# Altium project Nyquist_LA.PrjPcb
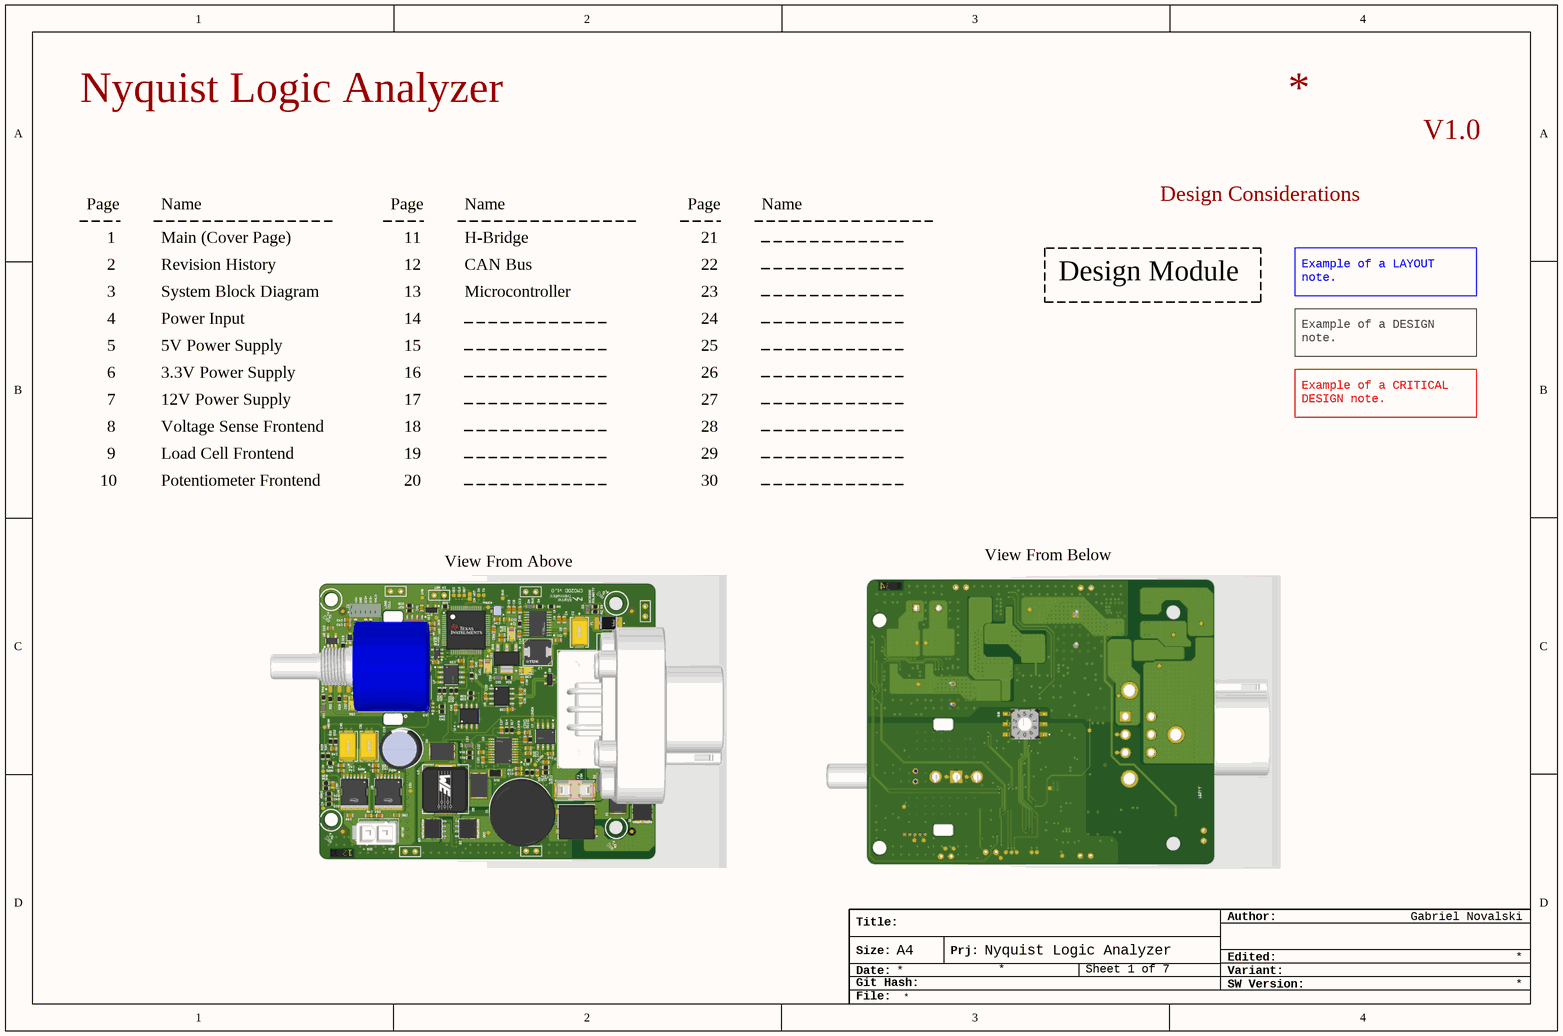
[diagram p0: Main.SchDoc]
ProjectTitle: Nyquist Logic Analyzer; Author: Gabriel Novalski
9 sheets, 204 parts. Net scope: strictly hierarchical (ports join the sheet entries above them; power ports are local).
Board file: PCB.PcbDoc
Sheets:
  Main.SchDoc
  Nyquist_LA_Top.SchDoc
    U_Power_Supply = Power_Supply.SchDoc
    U_USB_Input = USB_Input.SchDoc
    U_FPGA_iCE40HX4K = FPGA_iCE40HX4K.SchDoc
    U_Probe_Connectors = Probe_Connectors.SchDoc
    U_FT2232H_USB_Converter = FT2232H_USB_Converter.SchDoc
    U_JEDEC_TSSOP54_SDRAM = JEDEC_TSSOP54_SDRAM.SchDoc
    U_Input_Frontend = Input_Comparator_Frontend.SchDoc
    U_Input_Frontend = Input_Comparator_Frontend.SchDoc
    U_Input_Frontend = Input_Comparator_Frontend.SchDoc
    U_Input_Frontend = Input_Comparator_Frontend.SchDoc

## Sheet Main.SchDoc
size A4; SheetNumber: 1; SheetTotal: 7

### Notes on the sheet
- Nyquist Logic Analyzer
- V1.0
- Page
- 1
- Name
- Main (Cover Page)
- 11
- H-Bridge
- 21
- Design Considerations
- 2
- 3
- Revision History
- System Block Diagram
- 12
- 13
- CAN Bus
- Microcontroller
- 22
- 23
- Design Module
- Example of a LAYOUT note.
- 4
- 5
- 6
- Power Input
- 5V Power Supply
- 3.3V Power Supply
- 14
- 15
- 16
- 24
- 25
- 26
- Example of a DESIGN note.
- 7
- 8
- 12V Power Supply
- Voltage Sense Frontend
- 17
- 18
- 27
- 28
- Example of a CRITICAL DESIGN note.
- 10
- 9
- Load Cell Frontend
- Potentiometer Frontend
- 19
- 20
- 29
- 30
- View From Above
- View From Below
- Title:
- Author:
- Size:
- Date:
- Git Hash:
- A4
- Prj:
- SW Version:
- Variant:
- Edited:
- File:

## Sheet Nyquist_LA_Top.SchDoc: Nyquist LA Top
size A4; SheetNumber: 2; SheetTotal: 9
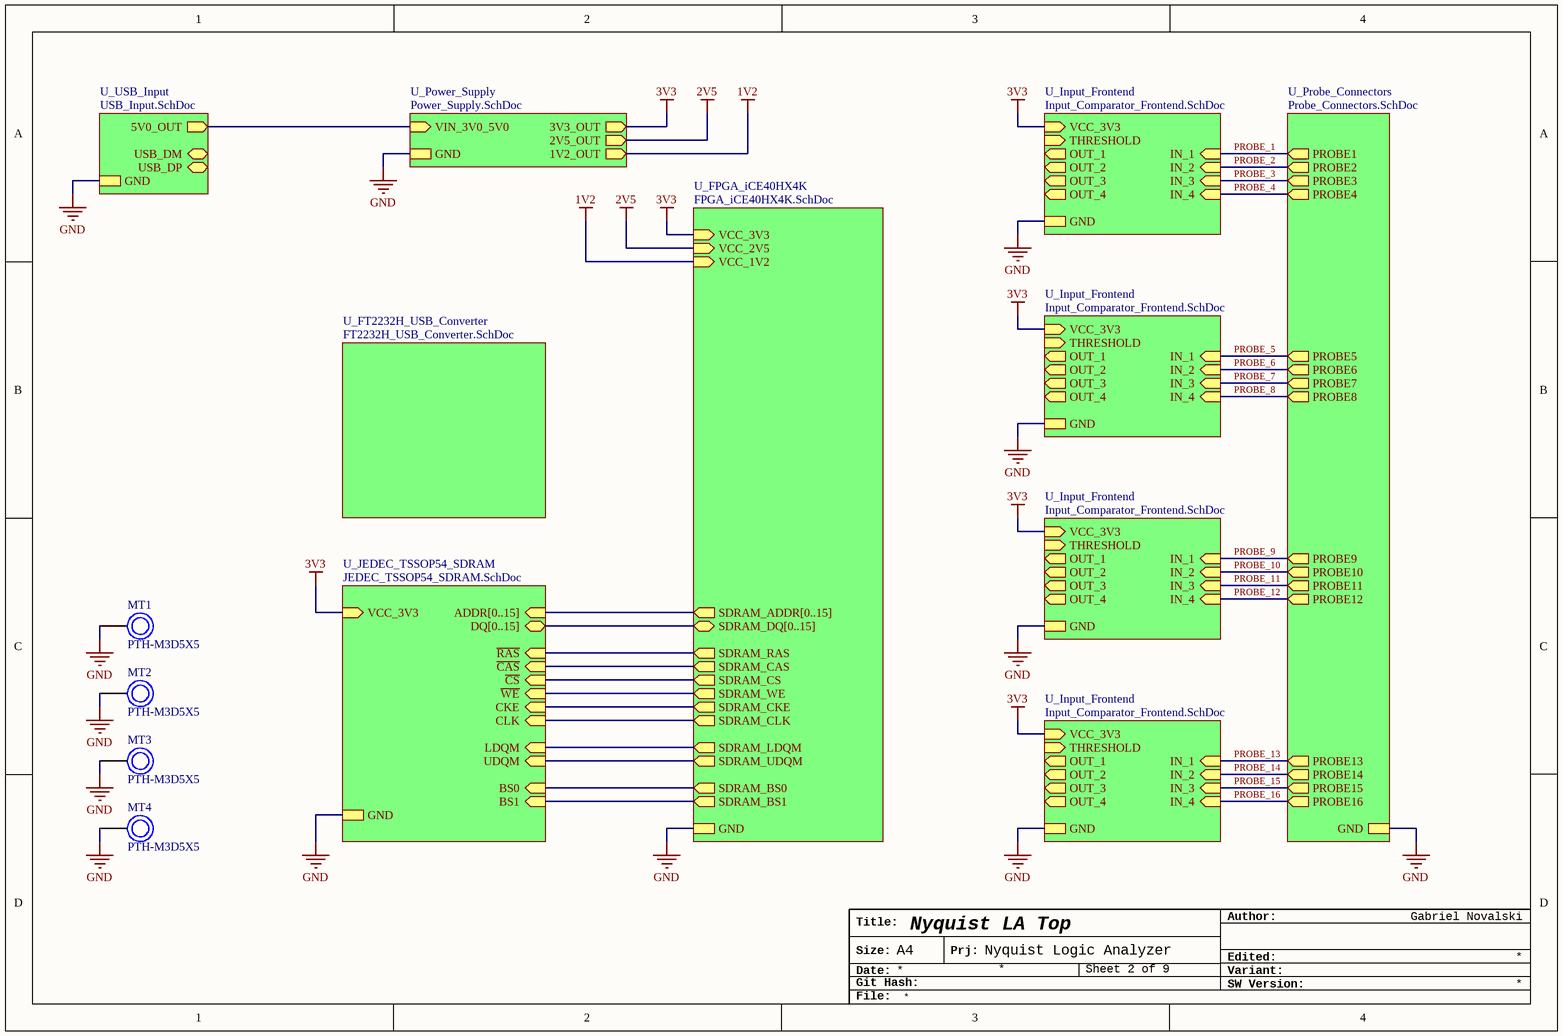
[diagram p1: Nyquist_LA_Top.SchDoc]

### Parts
MT1  PTH-M3D5X5  [M3_Mounting_Circular_Screw_L8mm]  (no BOM)
MT2  PTH-M3D5X5  [M3_Mounting_Circular_Screw_L8mm]  (no BOM)
MT3  PTH-M3D5X5  [M3_Mounting_Circular_Screw_L8mm]  (no BOM)
MT4  PTH-M3D5X5  [M3_Mounting_Circular_Screw_L8mm]  (no BOM)

### Sub-sheets
U_FPGA_iCE40HX4K = FPGA_iCE40HX4K.SchDoc: GND, VCC_3V3 (in), VCC_2V5 (in), VCC_1V2 (in), SDRAM_WE (out), SDRAM_CKE (out), SDRAM_CLK (out), SDRAM_LDQM (out), SDRAM_UDQM (out), SDRAM_BS0 (out), SDRAM_BS1 (out), SDRAM_ADDR[0..15] (out), SDRAM_DQ[0..15] (bidir), SDRAM_RAS (out), SDRAM_CAS (out), SDRAM_CS (out)
U_FT2232H_USB_Converter = FT2232H_USB_Converter.SchDoc: no entries
U_Input_Frontend = Input_Comparator_Frontend.SchDoc: IN_1 (in), IN_2 (in), IN_3 (in), IN_4 (in), OUT_1 (out), OUT_2 (out), OUT_3 (out), OUT_4 (out), GND, VCC_3V3 (in), THRESHOLD (in)
U_Input_Frontend = Input_Comparator_Frontend.SchDoc: IN_1 (in), IN_2 (in), IN_3 (in), IN_4 (in), OUT_1 (out), OUT_2 (out), OUT_3 (out), OUT_4 (out), GND, VCC_3V3 (in), THRESHOLD (in)
U_Input_Frontend = Input_Comparator_Frontend.SchDoc: IN_1 (in), IN_2 (in), IN_3 (in), IN_4 (in), OUT_1 (out), OUT_2 (out), OUT_3 (out), OUT_4 (out), GND, VCC_3V3 (in), THRESHOLD (in)
U_Input_Frontend = Input_Comparator_Frontend.SchDoc: IN_1 (in), IN_2 (in), IN_3 (in), IN_4 (in), OUT_1 (out), OUT_2 (out), OUT_3 (out), OUT_4 (out), GND, VCC_3V3 (in), THRESHOLD (in)
U_JEDEC_TSSOP54_SDRAM = JEDEC_TSSOP54_SDRAM.SchDoc: DQ[0..15] (bidir), ADDR[0..15] (in), GND, VCC_3V3 (in), ~{RAS} (in), ~{CAS} (in), ~{CS} (in), ~{WE} (in), CKE (in), CLK (in), LDQM (in), UDQM (in), BS0 (in), BS1 (in)
U_Power_Supply = Power_Supply.SchDoc: 3V3_OUT (out), 2V5_OUT (out), 1V2_OUT (out), VIN_3V0_5V0 (in), GND
U_Probe_Connectors = Probe_Connectors.SchDoc: GND, PROBE1 (out), PROBE2 (out), PROBE3 (out), PROBE4 (out), PROBE5 (out), PROBE6 (out), PROBE7 (out), PROBE8 (out), PROBE9 (out), PROBE10 (out), PROBE11 (out), PROBE12 (out), PROBE13 (out), PROBE14 (out), PROBE15 (out), PROBE16 (out)
U_USB_Input = USB_Input.SchDoc: 5V0_OUT (out), GND, USB_DM (bidir), USB_DP (bidir)

### Nets
1V2: sheet U_Power_Supply/1V2_OUT, sheet U_FPGA_iCE40HX4K/VCC_1V2
2V5: sheet U_Power_Supply/2V5_OUT, sheet U_FPGA_iCE40HX4K/VCC_2V5
3V3: sheet U_Power_Supply/3V3_OUT, sheet U_FPGA_iCE40HX4K/VCC_3V3, sheet U_JEDEC_TSSOP54_SDRAM/VCC_3V3, sheet U_Input_Frontend/VCC_3V3, sheet U_Input_Frontend/VCC_3V3, sheet U_Input_Frontend/VCC_3V3, sheet U_Input_Frontend/VCC_3V3
GND: MT1.MT MT2.MT MT3.MT MT4.MT ; sheet U_Power_Supply/GND, sheet U_USB_Input/GND, sheet U_FPGA_iCE40HX4K/GND, sheet U_Probe_Connectors/GND, sheet U_JEDEC_TSSOP54_SDRAM/GND, sheet U_Input_Frontend/GND, sheet U_Input_Frontend/GND, sheet U_Input_Frontend/GND, sheet U_Input_Frontend/GND
VIN_5V0: sheet U_Power_Supply/VIN_3V0_5V0, sheet U_USB_Input/5V0_OUT
PROBE_1: sheet U_Probe_Connectors/PROBE1, sheet U_Input_Frontend/IN_1
PROBE_2: sheet U_Probe_Connectors/PROBE2, sheet U_Input_Frontend/IN_2
PROBE_3: sheet U_Probe_Connectors/PROBE3, sheet U_Input_Frontend/IN_3
PROBE_4: sheet U_Probe_Connectors/PROBE4, sheet U_Input_Frontend/IN_4
PROBE_5: sheet U_Probe_Connectors/PROBE5, sheet U_Input_Frontend/IN_1
PROBE_6: sheet U_Probe_Connectors/PROBE6, sheet U_Input_Frontend/IN_2
PROBE_7: sheet U_Probe_Connectors/PROBE7, sheet U_Input_Frontend/IN_3
PROBE_8: sheet U_Probe_Connectors/PROBE8, sheet U_Input_Frontend/IN_4
PROBE_9: sheet U_Probe_Connectors/PROBE9, sheet U_Input_Frontend/IN_1
PROBE_10: sheet U_Probe_Connectors/PROBE10, sheet U_Input_Frontend/IN_2
PROBE_11: sheet U_Probe_Connectors/PROBE11, sheet U_Input_Frontend/IN_3
PROBE_12: sheet U_Probe_Connectors/PROBE12, sheet U_Input_Frontend/IN_4
PROBE_13: sheet U_Probe_Connectors/PROBE13, sheet U_Input_Frontend/IN_1
PROBE_14: sheet U_Probe_Connectors/PROBE14, sheet U_Input_Frontend/IN_2
PROBE_15: sheet U_Probe_Connectors/PROBE15, sheet U_Input_Frontend/IN_3
PROBE_16: sheet U_Probe_Connectors/PROBE16, sheet U_Input_Frontend/IN_4
SDRAM_#CAS: sheet U_FPGA_iCE40HX4K/SDRAM_CAS, sheet U_JEDEC_TSSOP54_SDRAM/~{CAS}
SDRAM_#CS: sheet U_FPGA_iCE40HX4K/SDRAM_CS, sheet U_JEDEC_TSSOP54_SDRAM/~{CS}
SDRAM_#RAS: sheet U_FPGA_iCE40HX4K/SDRAM_RAS, sheet U_JEDEC_TSSOP54_SDRAM/~{RAS}
SDRAM_#WE: sheet U_FPGA_iCE40HX4K/SDRAM_WE, sheet U_JEDEC_TSSOP54_SDRAM/~{WE}
SDRAM_BS0: sheet U_FPGA_iCE40HX4K/SDRAM_BS0, sheet U_JEDEC_TSSOP54_SDRAM/BS0
SDRAM_BS1: sheet U_FPGA_iCE40HX4K/SDRAM_BS1, sheet U_JEDEC_TSSOP54_SDRAM/BS1
SDRAM_CKE: sheet U_FPGA_iCE40HX4K/SDRAM_CKE, sheet U_JEDEC_TSSOP54_SDRAM/CKE
SDRAM_CLK: sheet U_FPGA_iCE40HX4K/SDRAM_CLK, sheet U_JEDEC_TSSOP54_SDRAM/CLK
SDRAM_LDQM: sheet U_FPGA_iCE40HX4K/SDRAM_LDQM, sheet U_JEDEC_TSSOP54_SDRAM/LDQM
SDRAM_UDQM: sheet U_FPGA_iCE40HX4K/SDRAM_UDQM, sheet U_JEDEC_TSSOP54_SDRAM/UDQM

### Buses and harness runs
bus sheet U_FPGA_iCE40HX4K/SDRAM_ADDR[0..15] = sheet U_JEDEC_TSSOP54_SDRAM/ADDR[0..15]
bus sheet U_FPGA_iCE40HX4K/SDRAM_DQ[0..15] = sheet U_JEDEC_TSSOP54_SDRAM/DQ[0..15]

### Notes on the sheet
- Title:
- Author:
- Size:
- Date:
- Git Hash:
- A4
- Prj:
- SW Version:
- Variant:
- Edited:
- File:

### Library data of the parts
MT1-MT4 = M3_Mounting_Hole: Mounting Hole 5mm x 5mm for M3 screws; Rule: UNIONINDEX=0|RULEKIND=PolygonConnect|NETSCOPE=AnyNet|LAYERKIND=SameLayer|NAME=Schematic Polygon Connect Style|CONNECTSTYLE=Direct|RELIEFCONDUCTORWIDTH=10mil|RELIEFENTRIES=4|POLYGONRELIEFANGLE=90 Angle|AIRGAPWIDTH=10mil|UNIT=Imperial

## Sheet Power_Supply.SchDoc: Power Supply
size A3; SheetNumber: 4; SheetTotal: 7
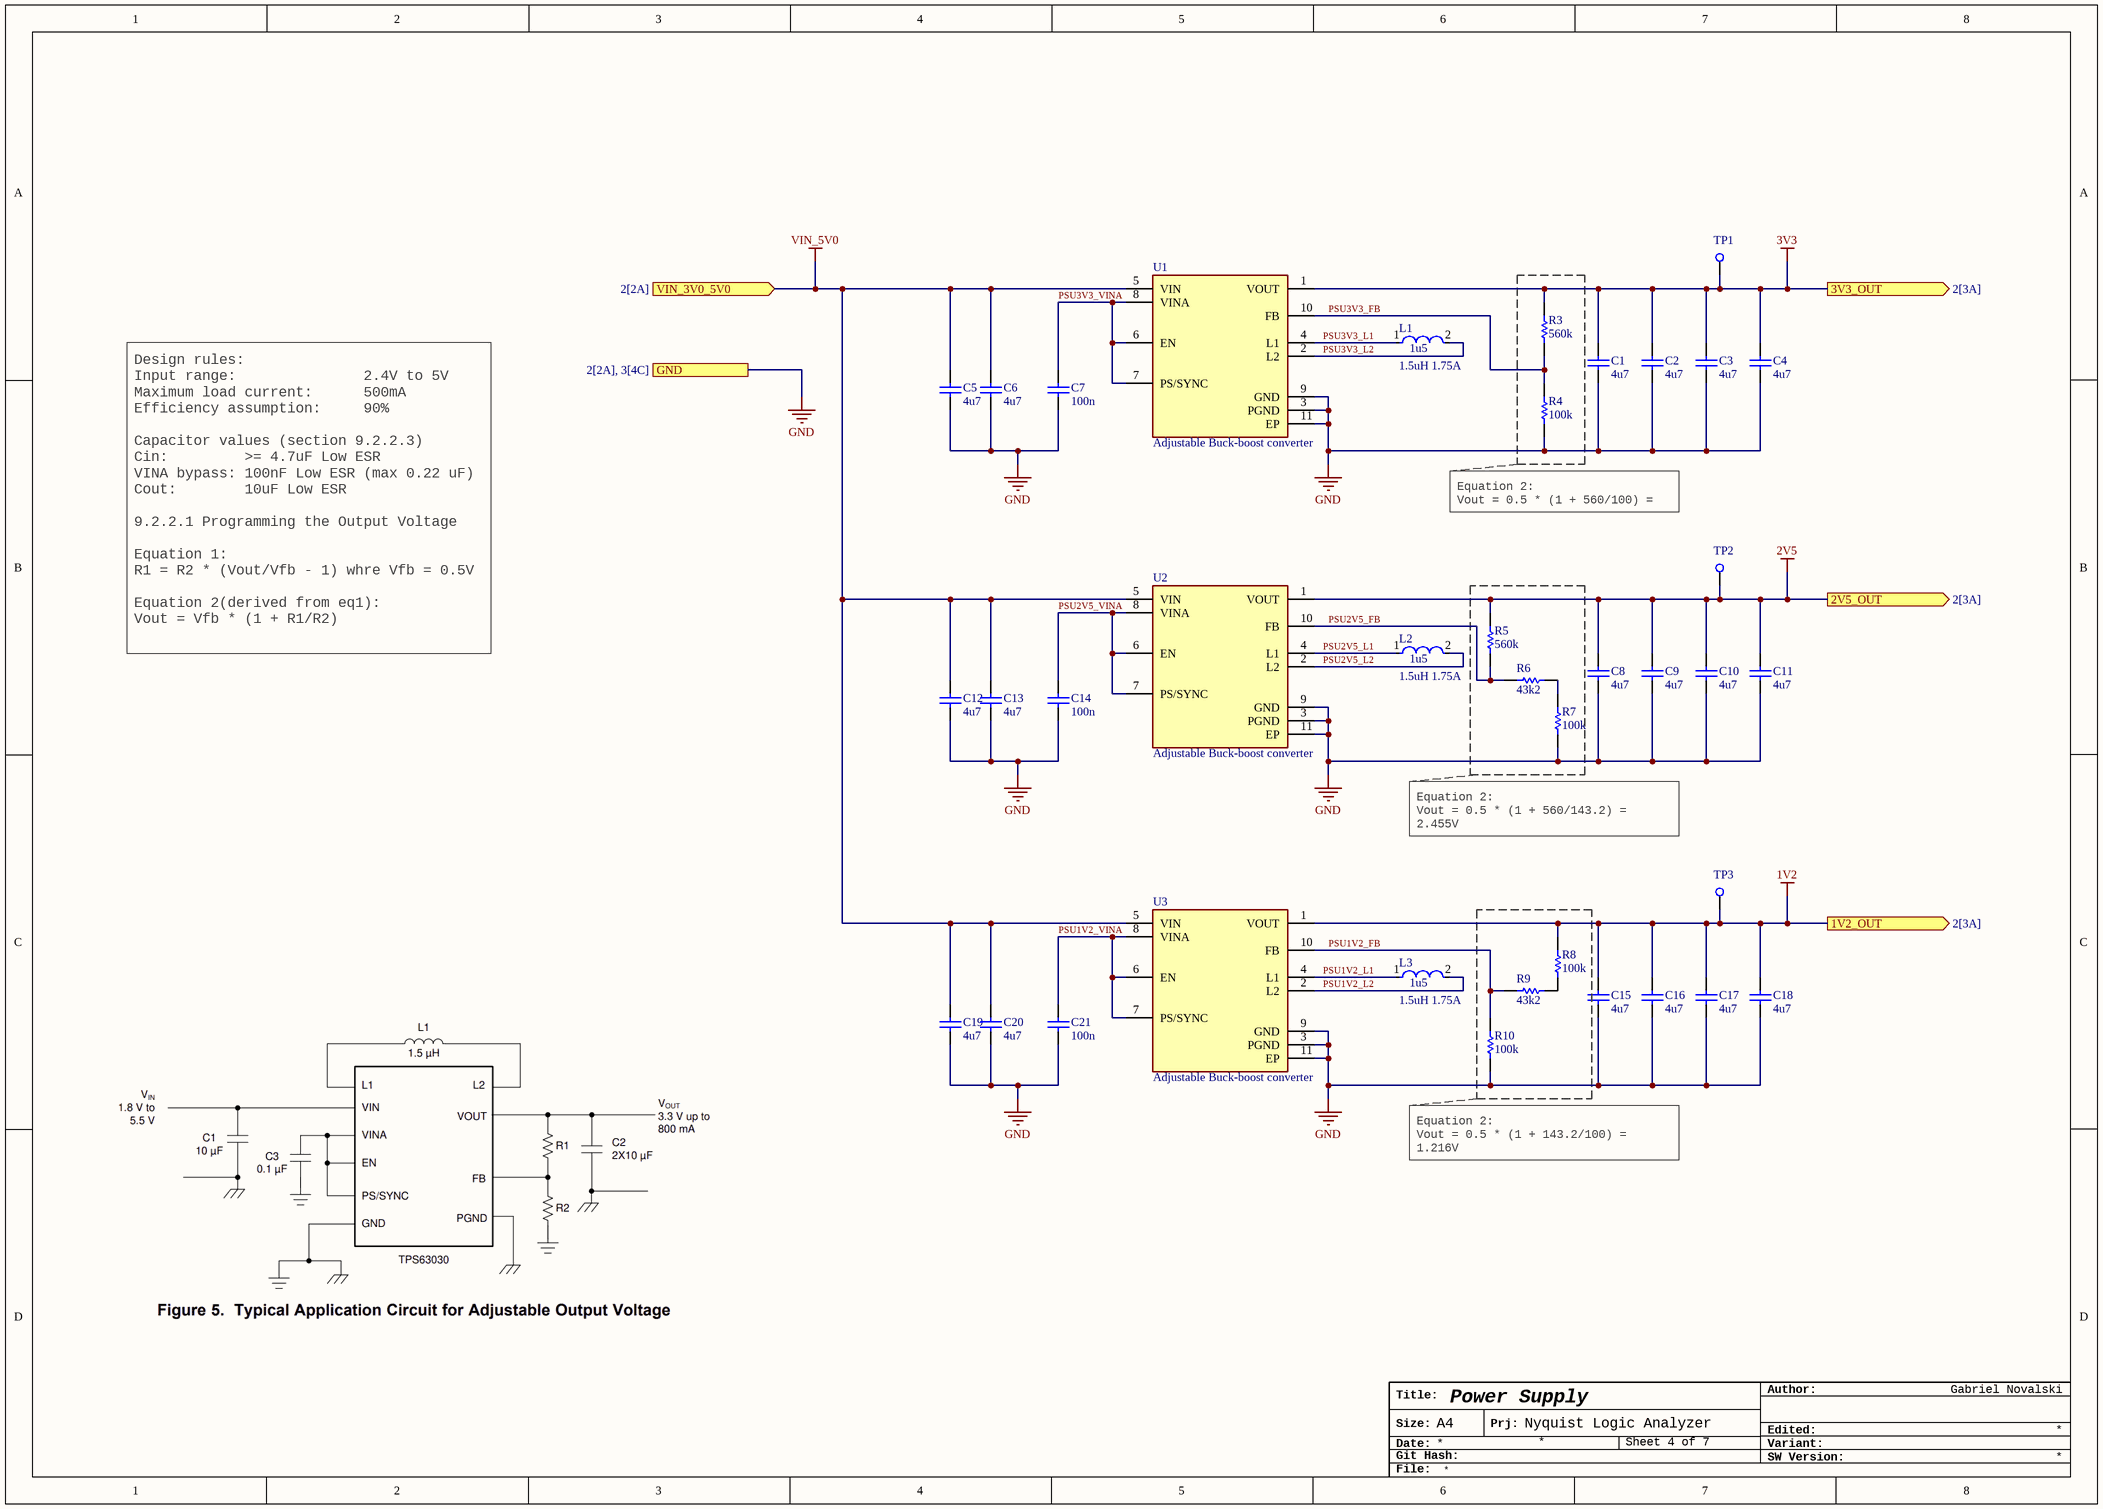
[diagram p2: Power_Supply.SchDoc]

### Parts
C1  value 4u7  [CAPC1607X09L - 0603]  (hidden comment: 4.7uF 35V)
C2  value 4u7  [CAPC1607X09L - 0603]  (hidden comment: 4.7uF 35V)
C3  value 4u7  [CAPC1607X09L - 0603]  (hidden comment: 4.7uF 35V)
C4  value 4u7  [CAPC1607X09L - 0603]  (hidden comment: 4.7uF 35V)
C5  value 4u7  [CAPC1607X09L - 0603]  (hidden comment: 4.7uF 35V)
C6  value 4u7  [CAPC1607X09L - 0603]  (hidden comment: 4.7uF 35V)
C7  value 100n  [CAPC1607X09L - 0603]  (hidden comment: 100nF 50V)
C8  value 4u7  [CAPC1607X09L - 0603]  (hidden comment: 4.7uF 35V)
C9  value 4u7  [CAPC1607X09L - 0603]  (hidden comment: 4.7uF 35V)
C10  value 4u7  [CAPC1607X09L - 0603]  (hidden comment: 4.7uF 35V)
C11  value 4u7  [CAPC1607X09L - 0603]  (hidden comment: 4.7uF 35V)
C12  value 4u7  [CAPC1607X09L - 0603]  (hidden comment: 4.7uF 35V)
C13  value 4u7  [CAPC1607X09L - 0603]  (hidden comment: 4.7uF 35V)
C14  value 100n  [CAPC1607X09L - 0603]  (hidden comment: 100nF 50V)
C15  value 4u7  [CAPC1607X09L - 0603]  (hidden comment: 4.7uF 35V)
C16  value 4u7  [CAPC1607X09L - 0603]  (hidden comment: 4.7uF 35V)
C17  value 4u7  [CAPC1607X09L - 0603]  (hidden comment: 4.7uF 35V)
C18  value 4u7  [CAPC1607X09L - 0603]  (hidden comment: 4.7uF 35V)
C19  value 4u7  [CAPC1607X09L - 0603]  (hidden comment: 4.7uF 35V)
C20  value 4u7  [CAPC1607X09L - 0603]  (hidden comment: 4.7uF 35V)
C21  value 100n  [CAPC1607X09L - 0603]  (hidden comment: 100nF 50V)
L1  1.5uH 1.75A  value 1u5  [LQH32PB_N0-MFG]
L2  1.5uH 1.75A  value 1u5  [LQH32PB_N0-MFG]
L3  1.5uH 1.75A  value 1u5  [LQH32PB_N0-MFG]
R3  560k  [RESC1508X05L - 0603]
R4  100k  [RESC1508X05L - 0603]
R5  560k  [RESC1508X05L - 0603]
R6  value 43k2  [RESC1508X05L - 0603]  (hidden comment: 43.2k)
R7  100k  [RESC1508X05L - 0603]
R8  100k  [RESC1508X05L - 0603]
R9  value 43k2  [RESC1508X05L - 0603]  (hidden comment: 43.2k)
R10  100k  [RESC1508X05L - 0603]
TP1  Test Point  [TP_CIRC_SMD_1mm]  (value not drawn)  (no BOM)
TP2  Test Point  [TP_CIRC_SMD_1mm]  (value not drawn)  (no BOM)
TP3  Test Point  [TP_CIRC_SMD_1mm]  (value not drawn)  (no BOM)
U1  Adjustable Buck-boost converter  [SON10_2.5x2.5_GEN]
U2  Adjustable Buck-boost converter  [SON10_2.5x2.5_GEN]
U3  Adjustable Buck-boost converter  [SON10_2.5x2.5_GEN]

### Ports
1V2_OUT (out, see 2[3A]), 2V5_OUT (out, see 2[3A]), 3V3_OUT (out, see 2[3A]), GND (see 2[2A], 3[4C]), VIN_3V0_5V0 (in, see 2[2A])

### Nets
1V2: C15.2 C16.2 C17.2 C18.2 R8.2 TP3.1 U3.1(VOUT) ; port 1V2_OUT
2V5: C8.2 C9.2 C10.2 C11.2 R5.2 TP2.1 U2.1(VOUT) ; port 2V5_OUT
3V3: C1.2 C2.2 C3.2 C4.2 R3.2 TP1.1 U1.1(VOUT) ; port 3V3_OUT
GND: C1.1 C2.1 C3.1 C4.1 C5.1 C6.1 C7.1 C8.1 C9.1 C10.1 C11.1 C12.1 C13.1 C14.1 C15.1 C16.1 C17.1 C18.1 C19.1 C20.1 C21.1 R4.1 R7.1 R10.1 U1.3(PGND) U1.9(GND) U1.11(EP) U2.3(PGND) U2.9(GND) U2.11(EP) U3.3(PGND) U3.9(GND) U3.11(EP) ; port GND
VIN_5V0: C5.2 C6.2 C12.2 C13.2 C19.2 C20.2 U1.5(VIN) U2.5(VIN) U3.5(VIN) ; port VIN_3V0_5V0
PSU1V2_FB: R9.2 R10.2 U3.10(FB)
PSU1V2_L1: L3.1 U3.4(L1)
PSU1V2_L2: L3.2 U3.2(L2)
PSU1V2_VINA: C21.2 U3.6(EN) U3.7(PS/SYNC) U3.8(VINA)
PSU2V5_FB: R5.1 R6.1 U2.10(FB)
PSU2V5_L1: L2.1 U2.4(L1)
PSU2V5_L2: L2.2 U2.2(L2)
PSU2V5_VINA: C14.2 U2.6(EN) U2.7(PS/SYNC) U2.8(VINA)
PSU3V3_FB: R3.1 R4.2 U1.10(FB)
PSU3V3_L1: L1.1 U1.4(L1)
PSU3V3_L2: L1.2 U1.2(L2)
PSU3V3_VINA: C7.2 U1.6(EN) U1.7(PS/SYNC) U1.8(VINA)
NetR6_2: R6.2 R7.2
NetR8_1: R8.1 R9.1

### Notes on the sheet
- Equation 2:
  Vout = 0.5 * (1 + 560/100) = 3.3V
- Design rules:
  Input range:               2.4V to 5V
  Maximum load current:      500mA
  Efficiency assumption:     90%
  Capacitor values (section 9.2.2.3)
  Cin:         >= 4.7uF Low ESR
  VINA bypass: 100nF Low ESR (max 0.22 uF)
  Cout:        10uF Low ESR
  9.2.2.1 Programming the Output Voltage
  Equation 1:
  R1 = R2 * (Vout/Vfb - 1) whre Vfb = 0.5V
  Equation 2(derived from eq1):
  Vout = Vfb * (1 + R1/R2)
- Equation 2:
  Vout = 0.5 * (1 + 560/143.2) = 2.455V
  1.8% off
- (near R10) Equation 2:
  Vout = 0.5 * (1 + 143.2/100) = 1.216V
  1.33% off
- Title:
- Author:
- Size:
- Date:
- Git Hash:
- A4
- Prj:
- SW Version:
- Variant:
- Edited:
- File:

### Library data of the parts
C1-C6 C8-C13 C15-C20 = CAP-0603-4.7uF-35V-X5R: Ceramic capacitor 4.7uF 35V X5R 0603; Supplier 1: DigiKey; Supplier Part Number 1: 490-7205-1-ND
C7 C14 C21 = CAP-0603-100nF-50V-X7R: Ceramic capacitor 100nF 50V X7R 0603; Supplier 1: DigiKey; Supplier Part Number 1: 490-5798-1-ND
L1-L3 = IND-1210-1.5uH-1.75A: 1.5 µH Shielded Drum Core, Wirewound Inductor 1.75 A 68.4mOhm Max; Supplier 1: DigiKey; Supplier Part Number 1: 490-5335-6-ND
R3 R5 = RES-0603-560k-1%: 560k ±1% 0603 100mW 75V; Part Number: 0402WGF1001TCE; Manufacturer: UNI-ROYAL; Supplier 1: DigiKey; Supplier Part Number 1: 311-100KHRCT-ND; Value: 560k
R4 R7 R8 R10 = RES-0603-100k-1%: 100k ±1% 0603 100mW 75V; Part Number: 0402WGF1001TCE; Manufacturer: UNI-ROYAL; Supplier 1: DigiKey; Supplier Part Number 1: 311-100KHRCT-ND; Value: 100k
R6 R9 = RES-0603-43.2k-1%: 43.2k ±1% 0603 100mW 75V; Part Number: 0402WGF1001TCE; Manufacturer: UNI-ROYAL; Supplier 1: DigiKey; Supplier Part Number 1: 311-43.2KHRCT-ND
TP1-TP3 = Test_Point_Pad: Test Point Pad
U1-U3 = IC-MPN-TPS63030: IC buck-boost regulator 900mA TPS63030 SON-10 TPS63031; Datasheet Link: http://www.ti.com/lit/gpn/tps63031

## Sheet USB_Input.SchDoc: USB Input
size A4; SheetNumber: 3; SheetTotal: 9
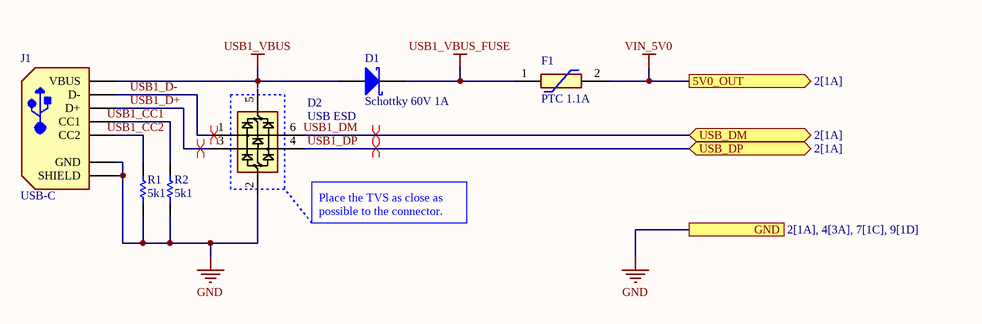
[diagram p3: USB_Input.SchDoc]

### Parts
D1  Schottky 60V 1A  [SOD123 - Nexperia]
D2  USB ESD  [SOT95P280X145-6N]
F1  PTC 1.1A  [LF_1812L010DR]
J1  USB-C  [AMPHENOL_12402012E212A]
R1  value 5k1  [RESC1508X05L - 0603]  (hidden comment: 5.1k)
R2  value 5k1  [RESC1508X05L - 0603]  (hidden comment: 5.1k)

### Ports
5V0_OUT (out, see 2[1A]), GND (see 2[1A], 4[3A], 7[1C], 9[1D]), USB_DM (bidir, see 2[1A]), USB_DP (bidir, see 2[1A])

### Nets
GND: D2.2(GND) J1.A1_B12(GND) J1.SH(SHIELD) R1.1 R2.1 ; port GND
USB1_VBUS: D1.1(A) J1.A4_B4(VBUS)
USB1_VBUS_FUSE: D1.2(K) F1.1
VIN_5V0: F1.2 ; port 5V0_OUT
USB1_CC1: J1.A5(CC1) R2.2
USB1_CC2: J1.B5(CC2) R1.2
USB1_D+: D2.3(I/O2_1) J1.A6_B6(D+)
USB1_D-: D2.1(I/O1_1) J1.A7_B7(D-)
USB1_DM: D2.6(I/O1_2) ; port USB_DM
USB1_DP: D2.4(I/O2_2) ; port USB_DP

Not connected (* = marked no-connect by the designer): D2 5(V_BUS)

### Layout directives
differential pair; differential pair class USB: USB1_D+, USB1_D-, USB1_DM, USB1_DP

### Notes on the sheet
- (near D2) Place the TVS as close as possible to the connector.
- Title:
- Author:
- Size:
- Date:
- Git Hash:
- A4
- Prj:
- SW Version:
- Variant:
- Edited:
- File:

### Library data of the parts
D1 = DIO-SOD123W-SCHOTTKY-60V-1A: Schottky diode 60V 1A SOD-123W; Manufacturer: Nexperia; RoHS Compliant: Yes; Supplier 1: Mouser; Supplier Part Number 1: 771-PMEG6010CEH-T/R
D2 = IC-MPN-USBLC6-2SC6Y: IC USB ESD protection SOT-23-6; Manufacturer_Name: STMicroelectronics; Datasheet Link: https://componentsearchengine.com/Datasheets/1/USBLC6-2SC6Y.pdf; Height: 1.45mm; Manufacturer_Part_Number: USBLC6-2SC6Y; Mouser Part Number: 511-USBLC6-2SC6Y; Mouser Price/Stock: https://www.mouser.co.uk/ProductDetail/STMicroelectronics/USBLC6-2SC6Y?qs=gNDSiZmRJS%2FOgDexvXkdow%3D%3D; Arrow Part Number: USBLC6-2SC6Y; Arrow Price/Stock: https://www.arrow.com/en/products/usblc6-2sc6y/stmicroelectronics?utm_currency=USD&region=nac
F1 = FUS-1812-PTC-1.1A-33V: 33V 1.1A 20A 1.95A 60mΩ 1812 PTC Resettable Fuses ROHS; Manufacturer_Name: LITTELFUSE; Manufacturer_Part_Number: 1812L110/33; Datasheet Link: http://www.littelfuse.com/~/media/electronics/datasheets/resettable_ptcs/littelfuse_ptc_1812l_datasheet.pdf.pdf; Height: 1.25mm; Mouser Part Number: N/A; Mouser Price/Stock: https://www.mouser.co.uk/ProductDetail/Littelfuse/1812L110-33?qs=skbisGc1mWUPu8SxwxrL5A%3D%3D; Supplier 1: Mouser; Supplier Part Number 1: 576-1812L110/33MR
J1 = CON-MPN-12402012E212A: USB-C 2.0 connector 24P; MF: Amphenol ICC (Commercial Products); MP: 12402012E212A; Price: None; Package: None; Availability: In Stock; SnapEDA_Link: https://www.snapeda.com/parts/12402012E212A/Amphenol/view-part/?ref=snap; Value: *; Check_prices: https://www.snapeda.com/parts/12402012E212A/Amphenol/view-part/?ref=eda; Purchase-URL: https://pricing.snapeda.com/search/part/12402012E212A/?ref=eda; Supplier 1: DigiKey; Supplier Part Number 1: 664-12402012E212ACT-ND
R1 R2 = RES-0603-5.1k-1%: 5.1k ±1% 0603 100mW 75V; Part Number: 0402WGF1001TCE; Manufacturer: UNI-ROYAL; Supplier 1: DigiKey; Supplier Part Number 1: 311-5.10KHRCT-ND

## Sheet FPGA_iCE40HX4K.SchDoc: FPGA iCE40HX4K
size A3; SheetNumber: 6; SheetTotal: 9
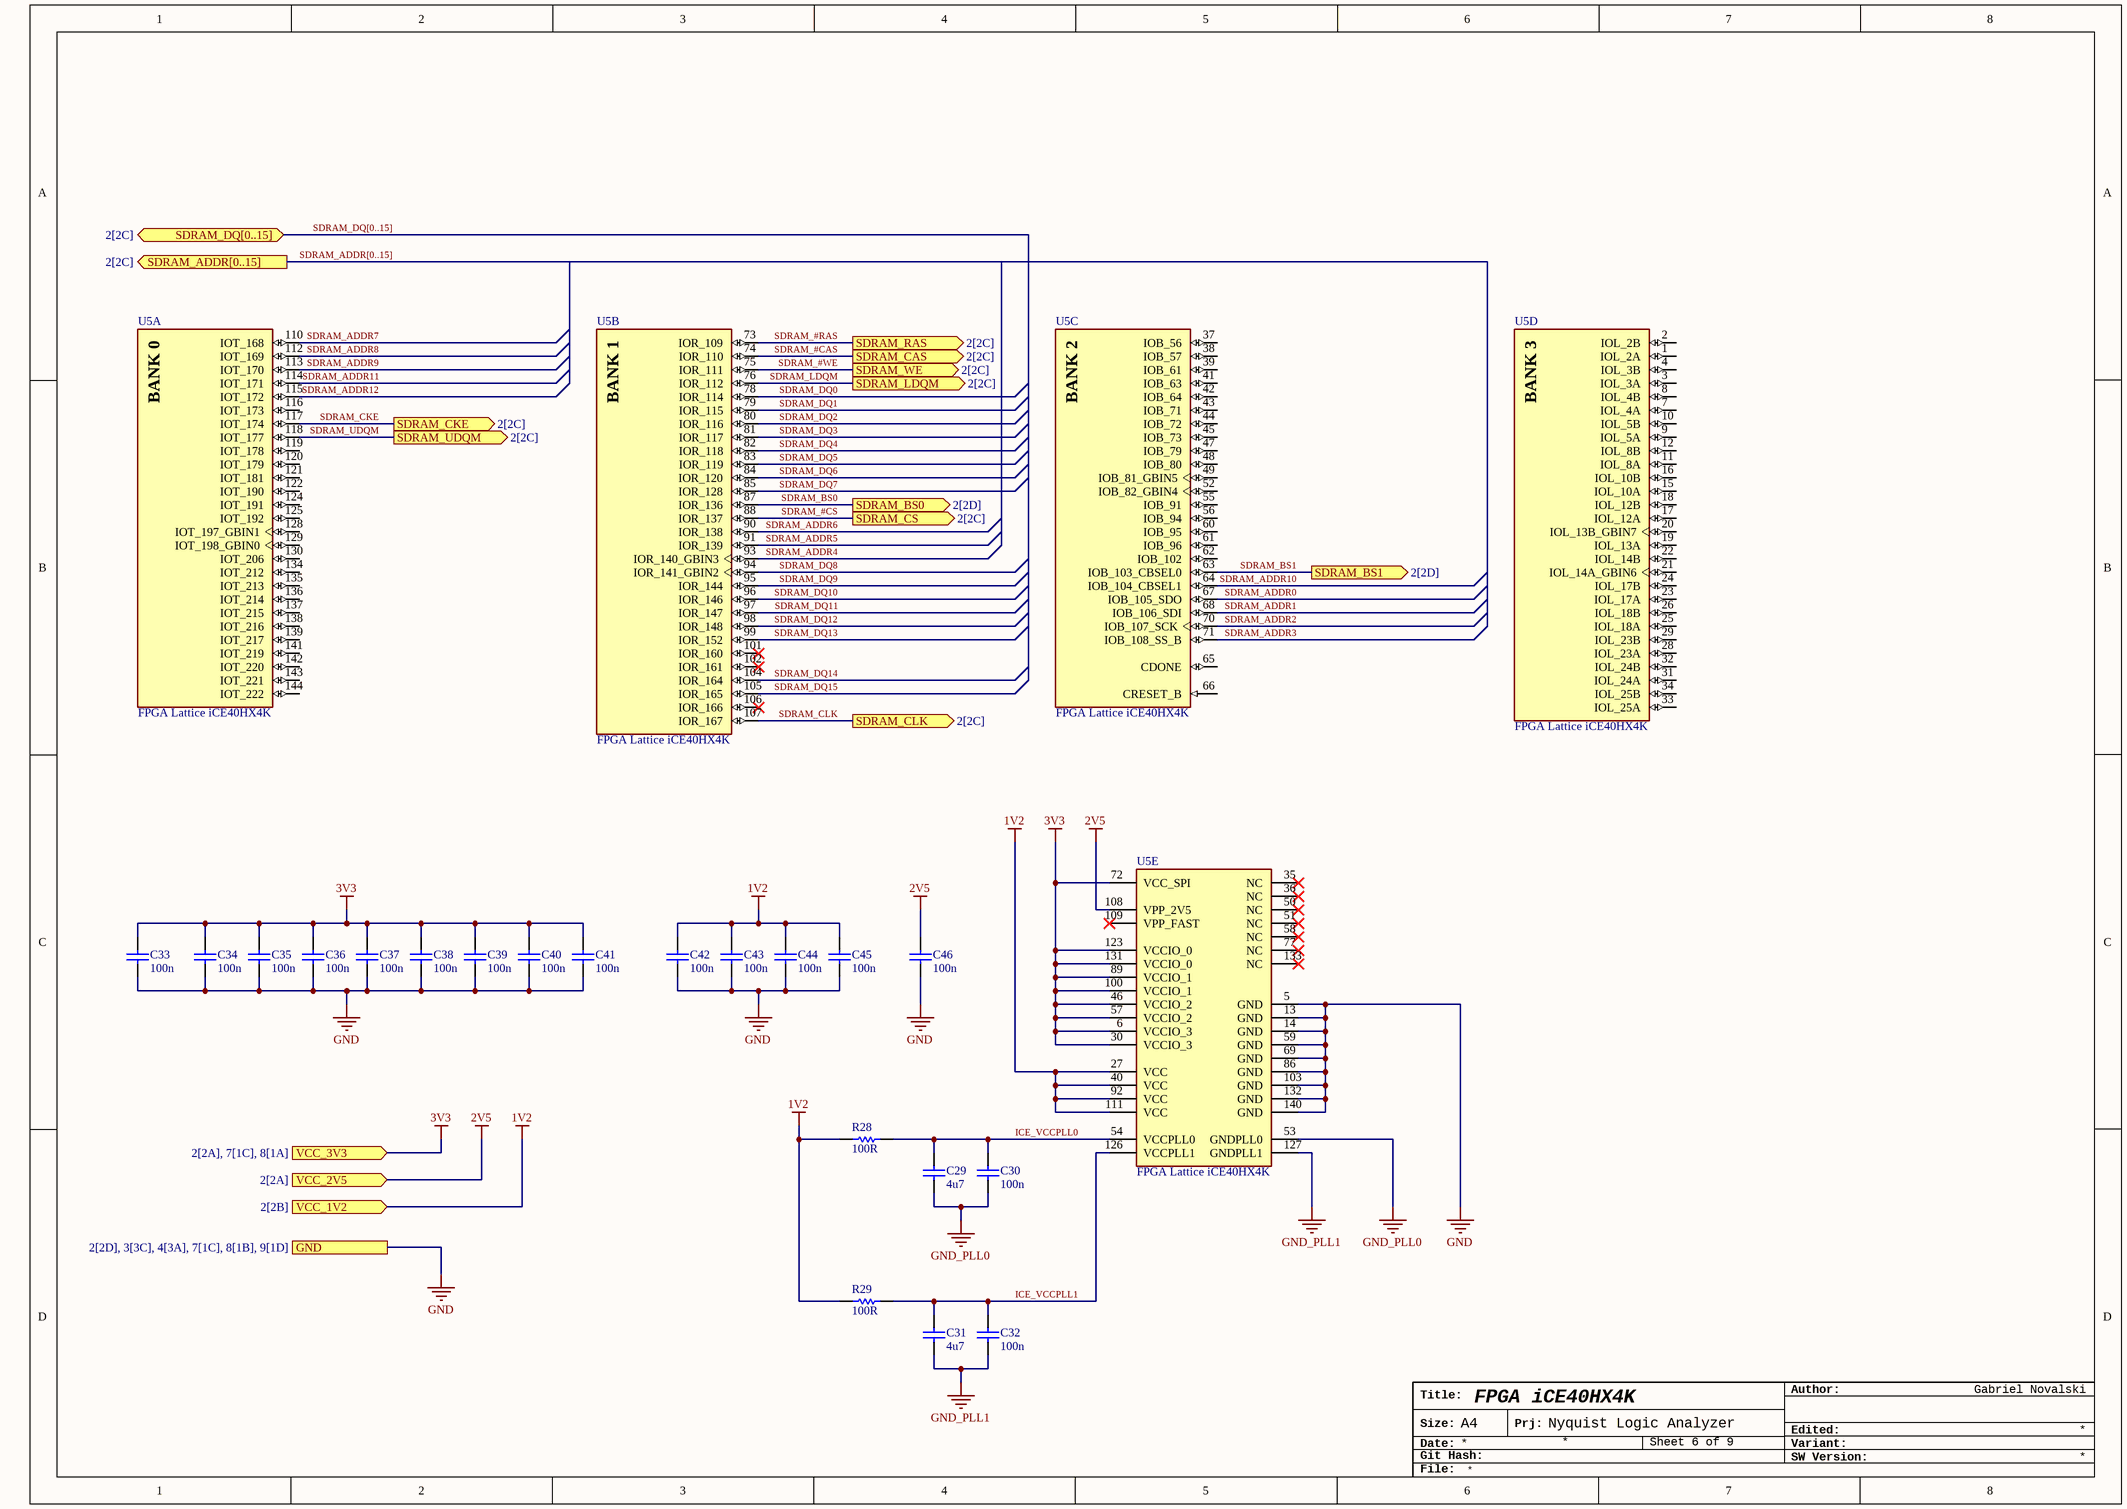
[diagram p4: FPGA_iCE40HX4K.SchDoc]

### Parts
C29  value 4u7  [CAPC1607X09L - 0603]  (hidden comment: 4.7uF 35V)
C30  value 100n  [CAPC1607X09L - 0603]  (hidden comment: 100nF 50V)
C31  value 4u7  [CAPC1607X09L - 0603]  (hidden comment: 4.7uF 35V)
C32  value 100n  [CAPC1607X09L - 0603]  (hidden comment: 100nF 50V)
C33  value 100n  [CAPC1607X09L - 0603]  (hidden comment: 100nF 50V)
C34  value 100n  [CAPC1607X09L - 0603]  (hidden comment: 100nF 50V)
C35  value 100n  [CAPC1607X09L - 0603]  (hidden comment: 100nF 50V)
C36  value 100n  [CAPC1607X09L - 0603]  (hidden comment: 100nF 50V)
C37  value 100n  [CAPC1607X09L - 0603]  (hidden comment: 100nF 50V)
C38  value 100n  [CAPC1607X09L - 0603]  (hidden comment: 100nF 50V)
C39  value 100n  [CAPC1607X09L - 0603]  (hidden comment: 100nF 50V)
C40  value 100n  [CAPC1607X09L - 0603]  (hidden comment: 100nF 50V)
C41  value 100n  [CAPC1607X09L - 0603]  (hidden comment: 100nF 50V)
C42  value 100n  [CAPC1607X09L - 0603]  (hidden comment: 100nF 50V)
C43  value 100n  [CAPC1607X09L - 0603]  (hidden comment: 100nF 50V)
C44  value 100n  [CAPC1607X09L - 0603]  (hidden comment: 100nF 50V)
C45  value 100n  [CAPC1607X09L - 0603]  (hidden comment: 100nF 50V)
C46  value 100n  [CAPC1607X09L - 0603]  (hidden comment: 100nF 50V)
R28  100R  [RESC1508X05L - 0603]
R29  100R  [RESC1508X05L - 0603]
U5  FPGA Lattice iCE40HX4K  [LQFP144_LATTICE]  (parts A,B,C,D,E of 5)

### Ports
GND (see 2[2D], 3[3C], 4[3A], 7[1C], 8[1B], 9[1D]), SDRAM_ADDR[0..15] (out, see 2[2C]), SDRAM_BS0 (out, see 2[2D]), SDRAM_BS1 (out, see 2[2D]), SDRAM_CAS (out, see 2[2C]), SDRAM_CKE (out, see 2[2C]), SDRAM_CLK (out, see 2[2C]), SDRAM_CS (out, see 2[2C]), SDRAM_DQ[0..15] (bidir, see 2[2C]), SDRAM_LDQM (out, see 2[2C]), SDRAM_RAS (out, see 2[2C]), SDRAM_UDQM (out, see 2[2C]), SDRAM_WE (out, see 2[2C]), VCC_1V2 (in, see 2[2B]), VCC_2V5 (in, see 2[2A]), VCC_3V3 (in, see 2[2A], 7[1C], 8[1A])

### Nets
1V2: C42.2 C43.2 C44.2 C45.2 R28.1 R29.1 U5.27(VCC) U5.40(VCC) U5.92(VCC) U5.111(VCC) ; port VCC_1V2
2V5: C46.2 U5.108(VPP_2V5) ; port VCC_2V5
3V3: C33.2 C34.2 C35.2 C36.2 C37.2 C38.2 C39.2 C40.2 C41.2 U5.6(VCCIO_3) U5.30(VCCIO_3) U5.46(VCCIO_2) U5.57(VCCIO_2) U5.72(VCC_SPI) U5.89(VCCIO_1) U5.100(VCCIO_1) U5.123(VCCIO_0) U5.131(VCCIO_0) ; port VCC_3V3
GND: C33.1 C34.1 C35.1 C36.1 C37.1 C38.1 C39.1 C40.1 C41.1 C42.1 C43.1 C44.1 C45.1 C46.1 U5.5(GND) U5.13(GND) U5.14(GND) U5.59(GND) U5.69(GND) U5.86(GND) U5.103(GND) U5.132(GND) U5.140(GND) ; port GND
GND_PLL0: C29.1 C30.1 U5.53(GNDPLL0)
GND_PLL1: C31.1 C32.1 U5.127(GNDPLL1)
ICE_VCCPLL0: C29.2 C30.2 R28.2 U5.54(VCCPLL0)
ICE_VCCPLL1: C31.2 C32.2 R29.2 U5.126(VCCPLL1)
SDRAM_#CAS: U5.74(IOR_110) ; port SDRAM_CAS
SDRAM_#CS: U5.88(IOR_137) ; port SDRAM_CS
SDRAM_#RAS: U5.73(IOR_109) ; port SDRAM_RAS
SDRAM_#WE: U5.75(IOR_111) ; port SDRAM_WE
SDRAM_ADDR0: U5.67(IOB_105_SDO)
SDRAM_ADDR1: U5.68(IOB_106_SDI)
SDRAM_ADDR2: U5.70(IOB_107_SCK)
SDRAM_ADDR3: U5.71(IOB_108_SS_B)
SDRAM_ADDR4: U5.93(IOR_140_GBIN3)
SDRAM_ADDR5: U5.91(IOR_139)
SDRAM_ADDR6: U5.90(IOR_138)
SDRAM_ADDR7: U5.110(IOT_168)
SDRAM_ADDR8: U5.112(IOT_169)
SDRAM_ADDR9: U5.113(IOT_170)
SDRAM_ADDR10: U5.64(IOB_104_CBSEL1)
SDRAM_ADDR11: U5.114(IOT_171)
SDRAM_ADDR12: U5.115(IOT_172)
SDRAM_BS0: U5.87(IOR_136) ; port SDRAM_BS0
SDRAM_BS1: U5.63(IOB_103_CBSEL0) ; port SDRAM_BS1
SDRAM_CKE: U5.117(IOT_174) ; port SDRAM_CKE
SDRAM_CLK: U5.107(IOR_167) ; port SDRAM_CLK
SDRAM_DQ0: U5.78(IOR_114)
SDRAM_DQ1: U5.79(IOR_115)
SDRAM_DQ2: U5.80(IOR_116)
SDRAM_DQ3: U5.81(IOR_117)
SDRAM_DQ4: U5.82(IOR_118)
SDRAM_DQ5: U5.83(IOR_119)
SDRAM_DQ6: U5.84(IOR_120)
SDRAM_DQ7: U5.85(IOR_128)
SDRAM_DQ8: U5.94(IOR_141_GBIN2)
SDRAM_DQ9: U5.95(IOR_144)
SDRAM_DQ10: U5.96(IOR_146)
SDRAM_DQ11: U5.97(IOR_147)
SDRAM_DQ12: U5.98(IOR_148)
SDRAM_DQ13: U5.99(IOR_152)
SDRAM_DQ14: U5.104(IOR_164)
SDRAM_DQ15: U5.105(IOR_165)
SDRAM_LDQM: U5.76(IOR_112) ; port SDRAM_LDQM
SDRAM_UDQM: U5.118(IOT_177) ; port SDRAM_UDQM

Not connected (* = marked no-connect by the designer): U5 1(IOL_2A) 2(IOL_2B) 3(IOL_3A) 4(IOL_3B) 7(IOL_4A) 8(IOL_4B) 9(IOL_5A) 10(IOL_5B) 11(IOL_8A) 12(IOL_8B) 15(IOL_10A) 16(IOL_10B) 17(IOL_12A) 18(IOL_12B) 19(IOL_13A) 20(IOL_13B_GBIN7) 21(IOL_14A_GBIN6) 22(IOL_14B) 23(IOL_17A) 24(IOL_17B) 25(IOL_18A) 26(IOL_18B) 28(IOL_23A) 29(IOL_23B) 31(IOL_24A) 32(IOL_24B) 33(IOL_25A) 34(IOL_25B) 35(NC)* 36(NC)* 37(IOB_56) 38(IOB_57) 39(IOB_61) 41(IOB_63) 42(IOB_64) 43(IOB_71) 44(IOB_72) 45(IOB_73) 47(IOB_79) 48(IOB_80) 49(IOB_81_GBIN5) 50(NC)* 51(NC)* 52(IOB_82_GBIN4) 55(IOB_91) 56(IOB_94) 58(NC)* 60(IOB_95) 61(IOB_96) 62(IOB_102) 65(CDONE) 66(CRESET_B) 77(NC)* 101(IOR_160)* 102(IOR_161)* 106(IOR_166)* 109(VPP_FAST)* 116(IOT_173) 119(IOT_178) 120(IOT_179) 121(IOT_181) 122(IOT_190) 124(IOT_191) 125(IOT_192) 128(IOT_197_GBIN1) 129(IOT_198_GBIN0) 130(IOT_206) 133(NC)* 134(IOT_212) 135(IOT_213) 136(IOT_214) 137(IOT_215) 138(IOT_216) 139(IOT_217) 141(IOT_219) 142(IOT_220) 143(IOT_221) 144(IOT_222)

### Buses and harness runs
bus SDRAM_ADDR[0..15] = port SDRAM_ADDR[0..15]
bus SDRAM_DQ[0..15] = port SDRAM_DQ[0..15]

### Notes on the sheet
- Title:
- Author:
- Size:
- Date:
- Git Hash:
- A4
- Prj:
- SW Version:
- Variant:
- Edited:
- File:
- (in symbol IC-MPN-ICE40HX4K-TQ144, part A) BANK 0
- (in symbol IC-MPN-ICE40HX4K-TQ144, part B) BANK 1
- (in symbol IC-MPN-ICE40HX4K-TQ144, part C) BANK 2
- (in symbol IC-MPN-ICE40HX4K-TQ144, part D) BANK 3

### Library data of the parts
C29 C31 = CAP-0603-4.7uF-35V-X5R: Ceramic capacitor 4.7uF 35V X5R 0603; Supplier 1: DigiKey; Supplier Part Number 1: 490-7205-1-ND
C30 C32-C46 = CAP-0603-100nF-50V-X7R: Ceramic capacitor 100nF 50V X7R 0603; Supplier 1: DigiKey; Supplier Part Number 1: 490-5798-1-ND
R28 R29 = RES-0603-100R-1%: 100R ±1% 0603 100mW 75V; Part Number: 0402WGF1001TCE; Manufacturer: UNI-ROYAL; Supplier 1: DigiKey; Supplier Part Number 1: 311-100HRCT-ND; Value: 100R
U5 = IC-MPN-ICE40HX4K-TQ144: iCE40 HX4K Series FPGA Family, 3520 Logic Cells, 1.2 V Core, 80 K Embedded RAM Bits, TQFP-144; ComponentLink2URL: http://www.latticesemi.com/~/media/Documents/DataSheets/iCE/iCE40LPHXFamilyDataSheet.pdf; ComponentLink1Description: Manufacturer URL; ComponentLink3URL: http://www.latticesemi.com/lit/docs/package/pkg.pdf; ComponentLink3Description: Package Specification; ComponentLink1URL: http://www.latticesemi.com/en; ComponentLink2Description: Datasheet

## Sheet Probe_Connectors.SchDoc: Input Connector
size A4; SheetNumber: 000; SheetTotal: 999
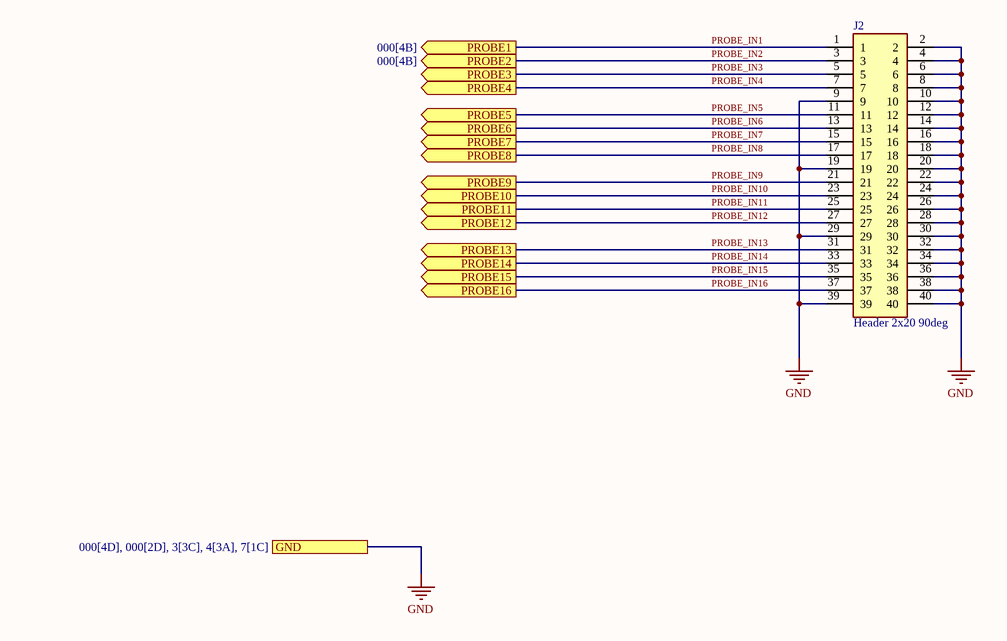
[diagram p5: Probe_Connectors.SchDoc]

### Parts
J2  Header 2x20 90deg  [SULLINS_PPPC202LJBN-RC]

### Ports
GND (see 000[4D], 000[2D], 3[3C], 4[3A], 7[1C]), PROBE1 (out, see 000[4B]), PROBE2 (out, see 000[4B]), PROBE3 (out), PROBE4 (out), PROBE5 (out), PROBE6 (out), PROBE7 (out), PROBE8 (out), PROBE9 (out), PROBE10 (out), PROBE11 (out), PROBE12 (out), PROBE13 (out), PROBE14 (out), PROBE15 (out), PROBE16 (out)

### Nets
GND: J2.2 J2.4 J2.6 J2.8 J2.9 J2.10 J2.12 J2.14 J2.16 J2.18 J2.19 J2.20 J2.22 J2.24 J2.26 J2.28 J2.29 J2.30 J2.32 J2.34 J2.36 J2.38 J2.39 J2.40 ; port GND
PROBE_IN1: J2.1 ; port PROBE1  [project net PROBE_1]
PROBE_IN2: J2.3 ; port PROBE2  [project net PROBE_2]
PROBE_IN3: J2.5 ; port PROBE3  [project net PROBE_3]
PROBE_IN4: J2.7 ; port PROBE4  [project net PROBE_4]
PROBE_IN5: J2.11 ; port PROBE5  [project net PROBE_5]
PROBE_IN6: J2.13 ; port PROBE6  [project net PROBE_6]
PROBE_IN7: J2.15 ; port PROBE7  [project net PROBE_7]
PROBE_IN8: J2.17 ; port PROBE8  [project net PROBE_8]
PROBE_IN9: J2.21 ; port PROBE9  [project net PROBE_9]
PROBE_IN10: J2.23 ; port PROBE10  [project net PROBE_10]
PROBE_IN11: J2.25 ; port PROBE11  [project net PROBE_11]
PROBE_IN12: J2.27 ; port PROBE12  [project net PROBE_12]
PROBE_IN13: J2.31 ; port PROBE13  [project net PROBE_13]
PROBE_IN14: J2.33 ; port PROBE14  [project net PROBE_14]
PROBE_IN15: J2.35 ; port PROBE15  [project net PROBE_15]
PROBE_IN16: J2.37 ; port PROBE16  [project net PROBE_16]

### Notes on the sheet
- Title:
- Author:
- Size:
- Date:
- Git Hash:
- A4
- Prj:
- SW Version:
- Variant:
- Edited:
- File:

### Library data of the parts
J2 = CON-HDR-90DEG-F-2x20-2.54mm: Female header 2x20 2.54mm THT

## Sheet FT2232H_USB_Converter.SchDoc: FT2232H USB Converter
size A4; SheetNumber: 5; SheetTotal: 6
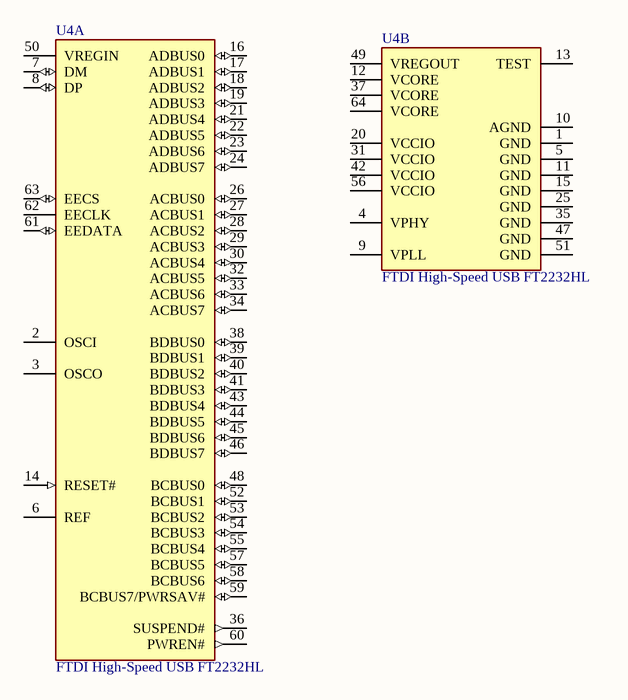
[diagram p6: FT2232H_USB_Converter.SchDoc]

### Parts
U4  FTDI High-Speed USB FT2232HL  [LQFP64_FTDI]  (parts A,B of 2)

### Nets

Not connected (* = marked no-connect by the designer): U4 1(GND) 2(OSCI) 3(OSCO) 4(VPHY) 5(GND) 6(REF) 7(DM) 8(DP) 9(VPLL) 10(AGND) 11(GND) 12(VCORE) 13(TEST) 14(RESET#) 15(GND) 16(ADBUS0) 17(ADBUS1) 18(ADBUS2) 19(ADBUS3) 20(VCCIO) 21(ADBUS4) 22(ADBUS5) 23(ADBUS6) 24(ADBUS7) 25(GND) 26(ACBUS0) 27(ACBUS1) 28(ACBUS2) 29(ACBUS3) 30(ACBUS4) 31(VCCIO) 32(ACBUS5) 33(ACBUS6) 34(ACBUS7) 35(GND) 36(SUSPEND#) 37(VCORE) 38(BDBUS0) 39(BDBUS1) 40(BDBUS2) 41(BDBUS3) 42(VCCIO) 43(BDBUS4) 44(BDBUS5) 45(BDBUS6) 46(BDBUS7) 47(GND) 48(BCBUS0) 49(VREGOUT) 50(VREGIN) 51(GND) 52(BCBUS1) 53(BCBUS2) 54(BCBUS3) 55(BCBUS4) 56(VCCIO) 57(BCBUS5) 58(BCBUS6) 59(BCBUS7/PWRSAV#) 60(PWREN#) 61(EEDATA) 62(EECLK) 63(EECS) 64(VCORE)

### Notes on the sheet
- Title:
- Author:
- Size:
- Date:
- Git Hash:
- A4
- Prj:
- SW Version:
- Variant:
- Edited:
- File:

### Library data of the parts
U4 = IC-MPN-FT2232HL: Dual High Speed USB to Multipurpose UART / FIFO IC, 3 to 3.6 V, LQFP-64; Number of Channels per Chip: 2; Standard Supported: RS232,RS422,RS485; Maximum Data Rate: 480Mbit/s; Package Description: 64-Pin Low-profile Quad Flat Package, Body 10 x 10 mm, Pitch 0.5 mm; Maximum Operating Temperature: +85°C; Mounting Technology: SurfaceMount; Pin Count: 64; Package Reference: LQFP-64; Manufacturer: FTDI; Manufacturer URL: http://www.nxp.com/; Length: 10mm; Width: 10mm; Minimum Operating Temperature: -40°C; Dimensions: 10x10x1.4mm; Package Type: LQFP; Mounting Type: SurfaceMount; Datasheet URL: http://www.ftdichip.com/Support/Documents/DataSheets/ICs/DS_FT2232H.pdf; Datasheet Version: Rev. 2.5, 07/2016; Height: 1.4mm

## Sheet JEDEC_TSSOP54_SDRAM.SchDoc: JEDEC TSSOP54 SDRAM
size A4; SheetNumber: 7; SheetTotal: 9
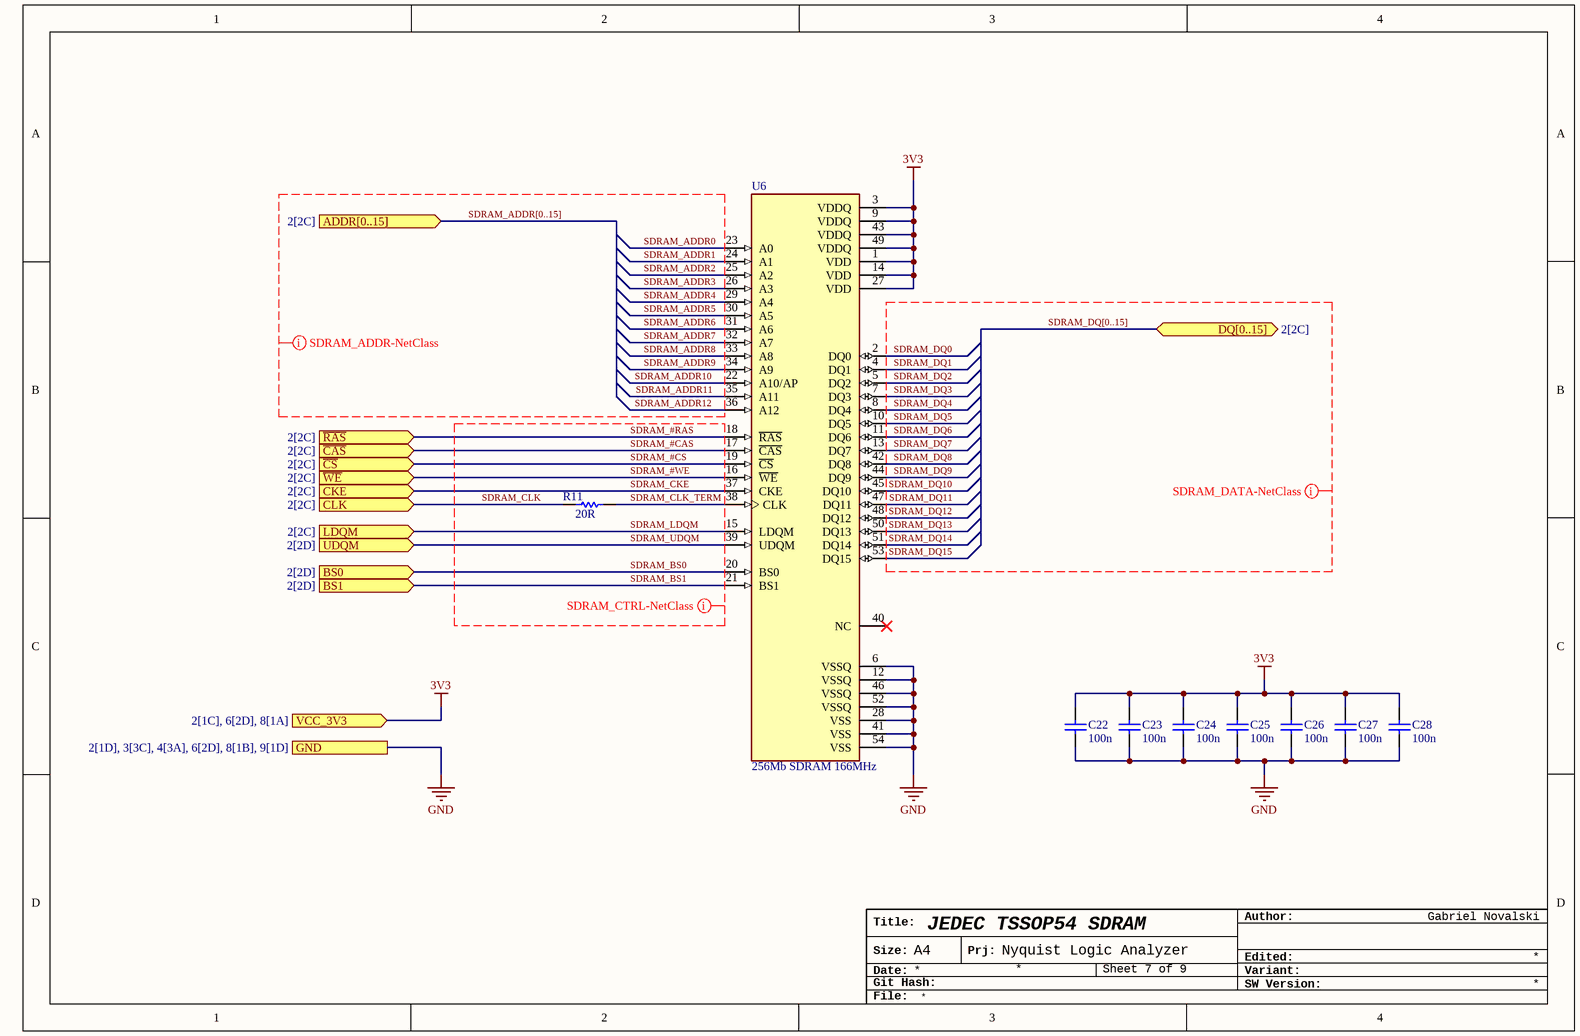
[diagram p7: JEDEC_TSSOP54_SDRAM.SchDoc]

### Parts
C22  value 100n  [CAPC1607X09L - 0603]  (hidden comment: 100nF 50V)
C23  value 100n  [CAPC1607X09L - 0603]  (hidden comment: 100nF 50V)
C24  value 100n  [CAPC1607X09L - 0603]  (hidden comment: 100nF 50V)
C25  value 100n  [CAPC1607X09L - 0603]  (hidden comment: 100nF 50V)
C26  value 100n  [CAPC1607X09L - 0603]  (hidden comment: 100nF 50V)
C27  value 100n  [CAPC1607X09L - 0603]  (hidden comment: 100nF 50V)
C28  value 100n  [CAPC1607X09L - 0603]  (hidden comment: 100nF 50V)
R11  20R  [RESC1508X05L - 0603]
U6  256Mb SDRAM 166MHz  [TSSOP54_GEN]

### Ports
ADDR[0..15] (in, see 2[2C]), BS0 (in, see 2[2D]), BS1 (in, see 2[2D]), CKE (in, see 2[2C]), CLK (in, see 2[2C]), DQ[0..15] (bidir, see 2[2C]), GND (see 2[1D], 3[3C], 4[3A], 6[2D], 8[1B], 9[1D]), LDQM (in, see 2[2C]), UDQM (in, see 2[2D]), VCC_3V3 (in, see 2[1C], 6[2D], 8[1A]), ~{CAS} (in, see 2[2C]), ~{CS} (in, see 2[2C]), ~{RAS} (in, see 2[2C]), ~{WE} (in, see 2[2C])

### Nets
3V3: C22.2 C23.2 C24.2 C25.2 C26.2 C27.2 C28.2 U6.1(VDD) U6.3(VDDQ) U6.9(VDDQ) U6.14(VDD) U6.27(VDD) U6.43(VDDQ) U6.49(VDDQ) ; port VCC_3V3
GND: C22.1 C23.1 C24.1 C25.1 C26.1 C27.1 C28.1 U6.6(VSSQ) U6.12(VSSQ) U6.28(VSS) U6.41(VSS) U6.46(VSSQ) U6.52(VSSQ) U6.54(VSS) ; port GND
SDRAM_#CAS: U6.17(~{CAS}) ; port ~{CAS}
SDRAM_#CS: U6.19(~{CS}) ; port ~{CS}
SDRAM_#RAS: U6.18(~{RAS}) ; port ~{RAS}
SDRAM_#WE: U6.16(~{WE}) ; port ~{WE}
SDRAM_ADDR0: U6.23(A0)
SDRAM_ADDR1: U6.24(A1)
SDRAM_ADDR2: U6.25(A2)
SDRAM_ADDR3: U6.26(A3)
SDRAM_ADDR4: U6.29(A4)
SDRAM_ADDR5: U6.30(A5)
SDRAM_ADDR6: U6.31(A6)
SDRAM_ADDR7: U6.32(A7)
SDRAM_ADDR8: U6.33(A8)
SDRAM_ADDR9: U6.34(A9)
SDRAM_ADDR10: U6.22(A10/AP)
SDRAM_ADDR11: U6.35(A11)
SDRAM_ADDR12: U6.36(A12)
SDRAM_BS0: U6.20(BS0) ; port BS0
SDRAM_BS1: U6.21(BS1) ; port BS1
SDRAM_CKE: U6.37(CKE) ; port CKE
SDRAM_CLK: R11.1 ; port CLK
SDRAM_CLK_TERM: R11.2 U6.38(CLK)
SDRAM_DQ0: U6.2(DQ0)
SDRAM_DQ1: U6.4(DQ1)
SDRAM_DQ2: U6.5(DQ2)
SDRAM_DQ3: U6.7(DQ3)
SDRAM_DQ4: U6.8(DQ4)
SDRAM_DQ5: U6.10(DQ5)
SDRAM_DQ6: U6.11(DQ6)
SDRAM_DQ7: U6.13(DQ7)
SDRAM_DQ8: U6.42(DQ8)
SDRAM_DQ9: U6.44(DQ9)
SDRAM_DQ10: U6.45(DQ10)
SDRAM_DQ11: U6.47(DQ11)
SDRAM_DQ12: U6.48(DQ12)
SDRAM_DQ13: U6.50(DQ13)
SDRAM_DQ14: U6.51(DQ14)
SDRAM_DQ15: U6.53(DQ15)
SDRAM_LDQM: U6.15(LDQM) ; port LDQM
SDRAM_UDQM: U6.39(UDQM) ; port UDQM

Not connected (* = marked no-connect by the designer): U6 40(NC)*

### Buses and harness runs
bus SDRAM_ADDR[0..15] = port ADDR[0..15]
bus SDRAM_DQ[0..15] = port DQ[0..15]

### Layout directives
net class SDRAM_ADDR: SDRAM_#CAS, SDRAM_#CS, SDRAM_#RAS, SDRAM_#WE, SDRAM_ADDR0, SDRAM_ADDR1, SDRAM_ADDR2, SDRAM_ADDR3, SDRAM_ADDR4, SDRAM_ADDR5, SDRAM_ADDR6, SDRAM_ADDR7, SDRAM_ADDR8, SDRAM_ADDR9, SDRAM_ADDR10, SDRAM_ADDR11, SDRAM_ADDR12, SDRAM_ADDR[0..15], SDRAM_BS0, SDRAM_BS1, SDRAM_CKE, SDRAM_CLK, SDRAM_CLK_TERM, SDRAM_LDQM, SDRAM_UDQM
net class SDRAM_DATA: SDRAM_DQ0, SDRAM_DQ1, SDRAM_DQ2, SDRAM_DQ3, SDRAM_DQ4, SDRAM_DQ5, SDRAM_DQ6, SDRAM_DQ7, SDRAM_DQ8, SDRAM_DQ9, SDRAM_DQ10, SDRAM_DQ11, SDRAM_DQ12, SDRAM_DQ13, SDRAM_DQ14, SDRAM_DQ15, SDRAM_DQ[0..15]

### Notes on the sheet
- Title:
- Author:
- Size:
- Date:
- Git Hash:
- A4
- Prj:
- SW Version:
- Variant:
- Edited:
- File:

### Library data of the parts
C22-C28 = CAP-0603-100nF-50V-X7R: Ceramic capacitor 100nF 50V X7R 0603; Supplier 1: DigiKey; Supplier Part Number 1: 490-5798-1-ND
R11 = RES-0603-20R-1%: 20R ±1% 0603 100mW 75V; Part Number: 0402WGF1001TCE; Manufacturer: UNI-ROYAL; Supplier 1: DigiKey; Supplier Part Number 1: 13-RC0603FR-1020RLCT-ND; Value: 20R
U6 = IC-SDRAM-256Mb-JEDEC-TSSOP2: SDRAM Memory IC 256Mb (16M x 16) Parallel 166MHz 5ns 54-TSOP II

## Sheet Input_Comparator_Frontend.SchDoc: Input Comparator Frontend
size A4; SheetNumber: 8; SheetTotal: 9
Used 4 times, as channels U_Input_Frontend, U_Input_Frontend, U_Input_Frontend, U_Input_Frontend. Parts and nets are listed once, with the designators drawn on the sheet.
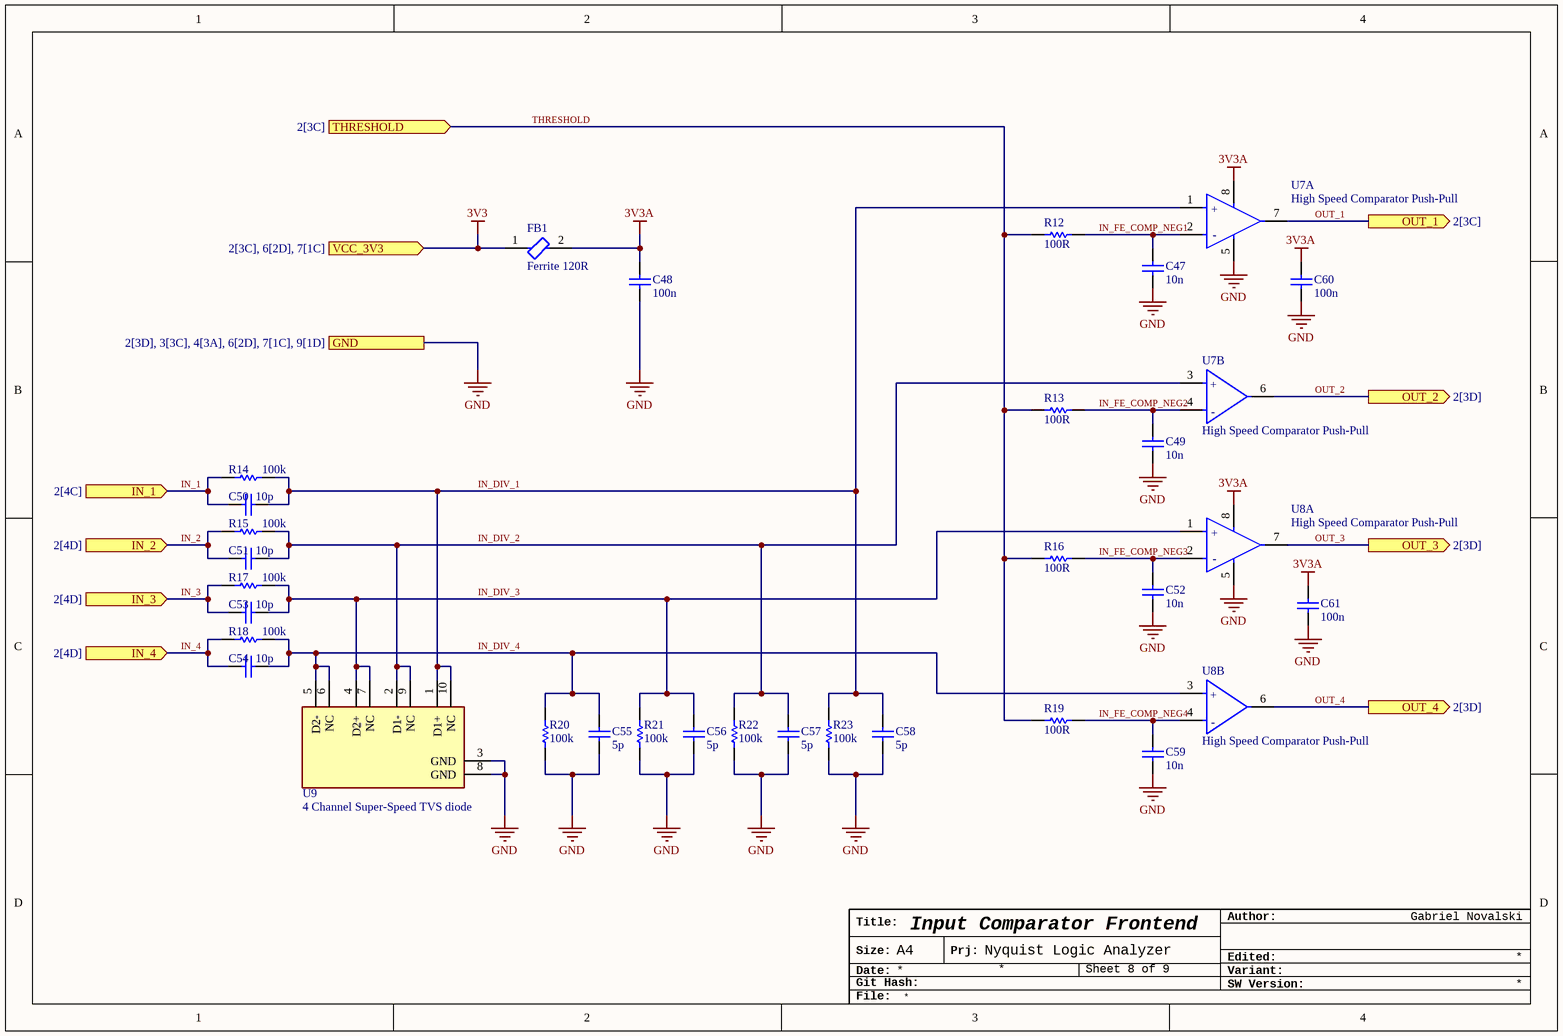
[diagram p8: Input_Comparator_Frontend.SchDoc]

### Parts
C47  value 10n  [CAPC1607X09L - 0603]  (hidden comment: 10nF 100V)
C48  value 100n  [CAPC1607X09L - 0603]  (hidden comment: 100nF 50V)
C49  value 10n  [CAPC1607X09L - 0603]  (hidden comment: 10nF 100V)
C50  value 10p  [CAPC1607X09L - 0603]  (hidden comment: 10pF 100V)
C51  value 10p  [CAPC1607X09L - 0603]  (hidden comment: 10pF 100V)
C52  value 10n  [CAPC1607X09L - 0603]  (hidden comment: 10nF 100V)
C53  value 10p  [CAPC1607X09L - 0603]  (hidden comment: 10pF 100V)
C54  value 10p  [CAPC1607X09L - 0603]  (hidden comment: 10pF 100V)
C55  value 5p  [CAPC1607X09L - 0603]  (hidden comment: 5pF 100V)
C56  value 5p  [CAPC1607X09L - 0603]  (hidden comment: 5pF 100V)
C57  value 5p  [CAPC1607X09L - 0603]  (hidden comment: 5pF 100V)
C58  value 5p  [CAPC1607X09L - 0603]  (hidden comment: 5pF 100V)
C59  value 10n  [CAPC1607X09L - 0603]  (hidden comment: 10nF 100V)
C60  value 100n  [CAPC1607X09L - 0603]  (hidden comment: 100nF 50V)
C61  value 100n  [CAPC1607X09L - 0603]  (hidden comment: 100nF 50V)
FB1  Ferrite 120R  [muRata 0603 Ferrite Bead]
R12  100R  [RESC1508X05L - 0603]
R13  100R  [RESC1508X05L - 0603]
R14  100k  [RESC1508X05L - 0603]
R15  100k  [RESC1508X05L - 0603]
R16  100R  [RESC1508X05L - 0603]
R17  100k  [RESC1508X05L - 0603]
R18  100k  [RESC1508X05L - 0603]
R19  100R  [RESC1508X05L - 0603]
R20  100k  [RESC1508X05L - 0603]
R21  100k  [RESC1508X05L - 0603]
R22  100k  [RESC1508X05L - 0603]
R23  100k  [RESC1508X05L - 0603]
U7  High Speed Comparator Push-Pull  [SOT23_8_TI]  (parts A,B of 2)
U8  High Speed Comparator Push-Pull  [SOT23_8_TI]  (parts A,B of 2)
U9  4 Channel Super-Speed TVS diode  [UFDFN10_TI]

### Ports
GND (see 2[3D], 3[3C], 4[3A], 6[2D], 7[1C], 9[1D]), IN_1 (in, see 2[4C]), IN_2 (in, see 2[4D]), IN_3 (in, see 2[4D]), IN_4 (in, see 2[4D]), OUT_1 (out, see 2[3C]), OUT_2 (out, see 2[3D]), OUT_3 (out, see 2[3D]), OUT_4 (out, see 2[3D]), THRESHOLD (in, see 2[3C]), VCC_3V3 (in, see 2[3C], 6[2D], 7[1C])

### Nets
3V3: FB1.1 ; port VCC_3V3
3V3A: C48.2 C60.2 C61.2 FB1.2 U7.8(V+) U8.8(V+)
GND: C47.1 C48.1 C49.1 C52.1 C55.1 C56.1 C57.1 C58.1 C59.1 C60.1 C61.1 R20.1 R21.1 R22.1 R23.1 U7.5(V-) U8.5(V-) U9.3(GND) U9.8(GND) ; port GND
IN_1: C50.1 R14.1 ; port IN_1
IN_2: C51.1 R15.1 ; port IN_2
IN_3: C53.1 R17.1 ; port IN_3
IN_4: C54.1 R18.1 ; port IN_4
IN_DIV_1: C50.2 C58.2 R14.2 R23.2 U7.1(+IN_A) U9.1(D1+) U9.10(NC)
IN_DIV_2: C51.2 C57.2 R15.2 R22.2 U7.3(+IN_B) U9.2(D1-) U9.9(NC)
IN_DIV_3: C53.2 C56.2 R17.2 R21.2 U8.1(+IN_A) U9.4(D2+) U9.7(NC)
IN_DIV_4: C54.2 C55.2 R18.2 R20.2 U8.3(+IN_B) U9.5(D2-) U9.6(NC)
IN_FE_COMP_NEG1: C47.2 R12.2 U7.2(-IN_A)
IN_FE_COMP_NEG2: C49.2 R13.2 U7.4(-IN_B)
IN_FE_COMP_NEG3: C52.2 R16.2 U8.2(-IN_A)
IN_FE_COMP_NEG4: C59.2 R19.2 U8.4(-IN_B)
OUT_1: U7.7(OUT_A) ; port OUT_1
OUT_2: U7.6(OUT_B) ; port OUT_2
OUT_3: U8.7(OUT_A) ; port OUT_3
OUT_4: U8.6(OUT_B) ; port OUT_4
THRESHOLD: R12.1 R13.1 R16.1 R19.1 ; port THRESHOLD

### Channels
U_Input_Frontend: designators end in _4; ports GND=GND IN_1=PROBE_1 IN_2=PROBE_2 IN_3=PROBE_3 IN_4=PROBE_4 OUT_1=OUT_1_U_Input_Frontend OUT_2=OUT_2_U_Input_Frontend OUT_3=OUT_3_U_Input_Frontend OUT_4=OUT_4_U_Input_Frontend THRESHOLD=THRESHOLD_U_Input_Frontend VCC_3V3=3V3
U_Input_Frontend: designators end in _3; ports GND=GND IN_1=PROBE_5 IN_2=PROBE_6 IN_3=PROBE_7 IN_4=PROBE_8 OUT_1=OUT_1_U_Input_Frontend OUT_2=OUT_2_U_Input_Frontend OUT_3=OUT_3_U_Input_Frontend OUT_4=OUT_4_U_Input_Frontend THRESHOLD=THRESHOLD_U_Input_Frontend VCC_3V3=3V3
U_Input_Frontend: designators end in _2; ports GND=GND IN_1=PROBE_9 IN_2=PROBE_10 IN_3=PROBE_11 IN_4=PROBE_12 OUT_1=OUT_1_U_Input_Frontend OUT_2=OUT_2_U_Input_Frontend OUT_3=OUT_3_U_Input_Frontend OUT_4=OUT_4_U_Input_Frontend THRESHOLD=THRESHOLD_U_Input_Frontend VCC_3V3=3V3
U_Input_Frontend: designators end in _1; ports GND=GND IN_1=PROBE_13 IN_2=PROBE_14 IN_3=PROBE_15 IN_4=PROBE_16 OUT_1=OUT_1_U_Input_Frontend OUT_2=OUT_2_U_Input_Frontend OUT_3=OUT_3_U_Input_Frontend OUT_4=OUT_4_U_Input_Frontend THRESHOLD=THRESHOLD_U_Input_Frontend VCC_3V3=3V3

### Notes on the sheet
- Title:
- Author:
- Size:
- Date:
- Git Hash:
- A4
- Prj:
- SW Version:
- Variant:
- Edited:
- File:
- (in symbol IC-MPN-TLV3502AIDCNR, part A) +; -
- (in symbol IC-MPN-TLV3502AIDCNR, part B) +; -

### Library data of the parts
C47 C49 C52 C59 = CAP-0603-10nF-100V-X7R: Ceramic capacitor 10nF 100V X7R 0603; Supplier 1: DigiKey; Supplier Part Number 1: 490-5771-1-ND
C48 C60 C61 = CAP-0603-100nF-50V-X7R: Ceramic capacitor 100nF 50V X7R 0603; Supplier 1: DigiKey; Supplier Part Number 1: 490-5798-1-ND
C50 C51 C53 C54 = CAP-0603-10pF-100V-NP0: Ceramic capacitor 10pF 100V NP0 0603; Supplier 1: DigiKey; Supplier Part Number 1: 490-4770-1-ND
C55-C58 = CAP-0603-5pF-100V-NP0: Ceramic capacitor 5pF 100V NP0 0603; Supplier 1: DigiKey; Supplier Part Number 1: 490-4770-1-ND
FB1 = FER-0603-120R-3A: Ferrite Bead, 0603, 75Ω @ 100MHz, 25%, 1Ω, 200mA; Max Current Rating: 3A; DC Resistance (DCR): 30mR; Number of Lines: 1; Package Quantity: 4000; Min Operating Temperature: -55°C; Termination: SMD/SMT; REACH SVHC: No SVHC; Core Material: Ferrite; Material: Ferrite; Current Rating: 3A; Impedance: 120R; Height: 0.8mm; Number of Pins: 2; Case/Package: 0603; Test Frequency: 100MHz; Case Code (Imperial): 0603; Series: BLM18K; Packaging: Tape and Reel; Inductor Type: FERRITE BEAD; Tolerance: 25%; Lead Free: Lead Free; Width: 0.8mm; Case Code (Metric): 1608; Number of Circuits: 1; Max DC Current: 3A; Depth: 0.95mm; Max Operating Temperature: 125°C; Length: 1.6mm; RoHS Compliant: Yes
R12 R13 R16 R19 = RES-0603-100R-1%: as R28 on sheet FPGA_iCE40HX4K; Supplier 1: DigiKey; Supplier Part Number 1: 311-100HRCT-ND; Value: 100R
R14 R15 R17 R18 R20-R23 = RES-0603-100k-1%: as R4 on sheet Power_Supply; Supplier 1: DigiKey; Supplier Part Number 1: 311-100KHRCT-ND; Value: 100k
U7 U8 = IC-MPN-TLV3502AIDCNR: ComponentLink2Description: Datasheet; ComponentLink2URL: http://www.ti.com/lit/ds/symlink/tlv3502.pdf
U9 = TVS-MPN-TPD4E05U06: 14V Clamp 2.5A (8/20µs) Ipp Tvs Diode Surface Mount USON-10; ComponentLink2Description: Datasheet; ComponentLink2URL: http://www.ti.com/lit/ds/symlink/tpd4e05u06-q1.pdf

## Nets that join several sheets
1V2: Power_Supply (7 pins), FPGA_iCE40HX4K (10 pins)
2V5: Power_Supply (7 pins), FPGA_iCE40HX4K (C46.2 U5.108)
3V3: Power_Supply (7 pins), FPGA_iCE40HX4K (18 pins), JEDEC_TSSOP54_SDRAM (14 pins), U_Input_Frontend (FB1_4.1), U_Input_Frontend (FB1_3.1), U_Input_Frontend (FB1_2.1), U_Input_Frontend (FB1_1.1)
GND: Nyquist_LA_Top (MT1.MT MT2.MT MT3.MT MT4.MT), Power_Supply (33 pins), USB_Input (5 pins), FPGA_iCE40HX4K (23 pins), Probe_Connectors (24 pins), JEDEC_TSSOP54_SDRAM (14 pins), U_Input_Frontend (19 pins), U_Input_Frontend (19 pins), U_Input_Frontend (19 pins), U_Input_Frontend (19 pins)
VIN_5V0: Power_Supply (9 pins), USB_Input (F1.2)
PROBE_1: Probe_Connectors (J2.1), U_Input_Frontend (C50_4.1 R14_4.1)
PROBE_2: Probe_Connectors (J2.3), U_Input_Frontend (C51_4.1 R15_4.1)
PROBE_3: Probe_Connectors (J2.5), U_Input_Frontend (C53_4.1 R17_4.1)
PROBE_4: Probe_Connectors (J2.7), U_Input_Frontend (C54_4.1 R18_4.1)
PROBE_5: Probe_Connectors (J2.11), U_Input_Frontend (C50_3.1 R14_3.1)
PROBE_6: Probe_Connectors (J2.13), U_Input_Frontend (C51_3.1 R15_3.1)
PROBE_7: Probe_Connectors (J2.15), U_Input_Frontend (C53_3.1 R17_3.1)
PROBE_8: Probe_Connectors (J2.17), U_Input_Frontend (C54_3.1 R18_3.1)
PROBE_9: Probe_Connectors (J2.21), U_Input_Frontend (C50_2.1 R14_2.1)
PROBE_10: Probe_Connectors (J2.23), U_Input_Frontend (C51_2.1 R15_2.1)
PROBE_11: Probe_Connectors (J2.25), U_Input_Frontend (C53_2.1 R17_2.1)
PROBE_12: Probe_Connectors (J2.27), U_Input_Frontend (C54_2.1 R18_2.1)
PROBE_13: Probe_Connectors (J2.31), U_Input_Frontend (C50_1.1 R14_1.1)
PROBE_14: Probe_Connectors (J2.33), U_Input_Frontend (C51_1.1 R15_1.1)
PROBE_15: Probe_Connectors (J2.35), U_Input_Frontend (C53_1.1 R17_1.1)
PROBE_16: Probe_Connectors (J2.37), U_Input_Frontend (C54_1.1 R18_1.1)
SDRAM_#CAS: FPGA_iCE40HX4K (U5.74), JEDEC_TSSOP54_SDRAM (U6.17)
SDRAM_#CS: FPGA_iCE40HX4K (U5.88), JEDEC_TSSOP54_SDRAM (U6.19)
SDRAM_#RAS: FPGA_iCE40HX4K (U5.73), JEDEC_TSSOP54_SDRAM (U6.18)
SDRAM_#WE: FPGA_iCE40HX4K (U5.75), JEDEC_TSSOP54_SDRAM (U6.16)
SDRAM_ADDR0: FPGA_iCE40HX4K (U5.67), JEDEC_TSSOP54_SDRAM (U6.23)
SDRAM_ADDR1: FPGA_iCE40HX4K (U5.68), JEDEC_TSSOP54_SDRAM (U6.24)
SDRAM_ADDR2: FPGA_iCE40HX4K (U5.70), JEDEC_TSSOP54_SDRAM (U6.25)
SDRAM_ADDR3: FPGA_iCE40HX4K (U5.71), JEDEC_TSSOP54_SDRAM (U6.26)
SDRAM_ADDR4: FPGA_iCE40HX4K (U5.93), JEDEC_TSSOP54_SDRAM (U6.29)
SDRAM_ADDR5: FPGA_iCE40HX4K (U5.91), JEDEC_TSSOP54_SDRAM (U6.30)
SDRAM_ADDR6: FPGA_iCE40HX4K (U5.90), JEDEC_TSSOP54_SDRAM (U6.31)
SDRAM_ADDR7: FPGA_iCE40HX4K (U5.110), JEDEC_TSSOP54_SDRAM (U6.32)
SDRAM_ADDR8: FPGA_iCE40HX4K (U5.112), JEDEC_TSSOP54_SDRAM (U6.33)
SDRAM_ADDR9: FPGA_iCE40HX4K (U5.113), JEDEC_TSSOP54_SDRAM (U6.34)
SDRAM_ADDR10: FPGA_iCE40HX4K (U5.64), JEDEC_TSSOP54_SDRAM (U6.22)
SDRAM_ADDR11: FPGA_iCE40HX4K (U5.114), JEDEC_TSSOP54_SDRAM (U6.35)
SDRAM_ADDR12: FPGA_iCE40HX4K (U5.115), JEDEC_TSSOP54_SDRAM (U6.36)
SDRAM_BS0: FPGA_iCE40HX4K (U5.87), JEDEC_TSSOP54_SDRAM (U6.20)
SDRAM_BS1: FPGA_iCE40HX4K (U5.63), JEDEC_TSSOP54_SDRAM (U6.21)
SDRAM_CKE: FPGA_iCE40HX4K (U5.117), JEDEC_TSSOP54_SDRAM (U6.37)
SDRAM_CLK: FPGA_iCE40HX4K (U5.107), JEDEC_TSSOP54_SDRAM (R11.1)
SDRAM_DQ0: FPGA_iCE40HX4K (U5.78), JEDEC_TSSOP54_SDRAM (U6.2)
SDRAM_DQ1: FPGA_iCE40HX4K (U5.79), JEDEC_TSSOP54_SDRAM (U6.4)
SDRAM_DQ2: FPGA_iCE40HX4K (U5.80), JEDEC_TSSOP54_SDRAM (U6.5)
SDRAM_DQ3: FPGA_iCE40HX4K (U5.81), JEDEC_TSSOP54_SDRAM (U6.7)
SDRAM_DQ4: FPGA_iCE40HX4K (U5.82), JEDEC_TSSOP54_SDRAM (U6.8)
SDRAM_DQ5: FPGA_iCE40HX4K (U5.83), JEDEC_TSSOP54_SDRAM (U6.10)
SDRAM_DQ6: FPGA_iCE40HX4K (U5.84), JEDEC_TSSOP54_SDRAM (U6.11)
SDRAM_DQ7: FPGA_iCE40HX4K (U5.85), JEDEC_TSSOP54_SDRAM (U6.13)
SDRAM_DQ8: FPGA_iCE40HX4K (U5.94), JEDEC_TSSOP54_SDRAM (U6.42)
SDRAM_DQ9: FPGA_iCE40HX4K (U5.95), JEDEC_TSSOP54_SDRAM (U6.44)
SDRAM_DQ10: FPGA_iCE40HX4K (U5.96), JEDEC_TSSOP54_SDRAM (U6.45)
SDRAM_DQ11: FPGA_iCE40HX4K (U5.97), JEDEC_TSSOP54_SDRAM (U6.47)
SDRAM_DQ12: FPGA_iCE40HX4K (U5.98), JEDEC_TSSOP54_SDRAM (U6.48)
SDRAM_DQ13: FPGA_iCE40HX4K (U5.99), JEDEC_TSSOP54_SDRAM (U6.50)
SDRAM_DQ14: FPGA_iCE40HX4K (U5.104), JEDEC_TSSOP54_SDRAM (U6.51)
SDRAM_DQ15: FPGA_iCE40HX4K (U5.105), JEDEC_TSSOP54_SDRAM (U6.53)
SDRAM_LDQM: FPGA_iCE40HX4K (U5.76), JEDEC_TSSOP54_SDRAM (U6.15)
SDRAM_UDQM: FPGA_iCE40HX4K (U5.118), JEDEC_TSSOP54_SDRAM (U6.39)